# EasyEDA Pro project ProPrj_CSDR_2026-11-13.epro, schematic Schematic1, sheets 1 to 4 of 14

## Sheets
1 MCU: Board Name: Board1; Create Date: 2026-09-28; Page Name: P2; Project Name: CSDR; Schematic Name: Schematic1; Update Date: 2026-09-28; Company: EasyEDA.com; Page Size: A4; Version: V1.0
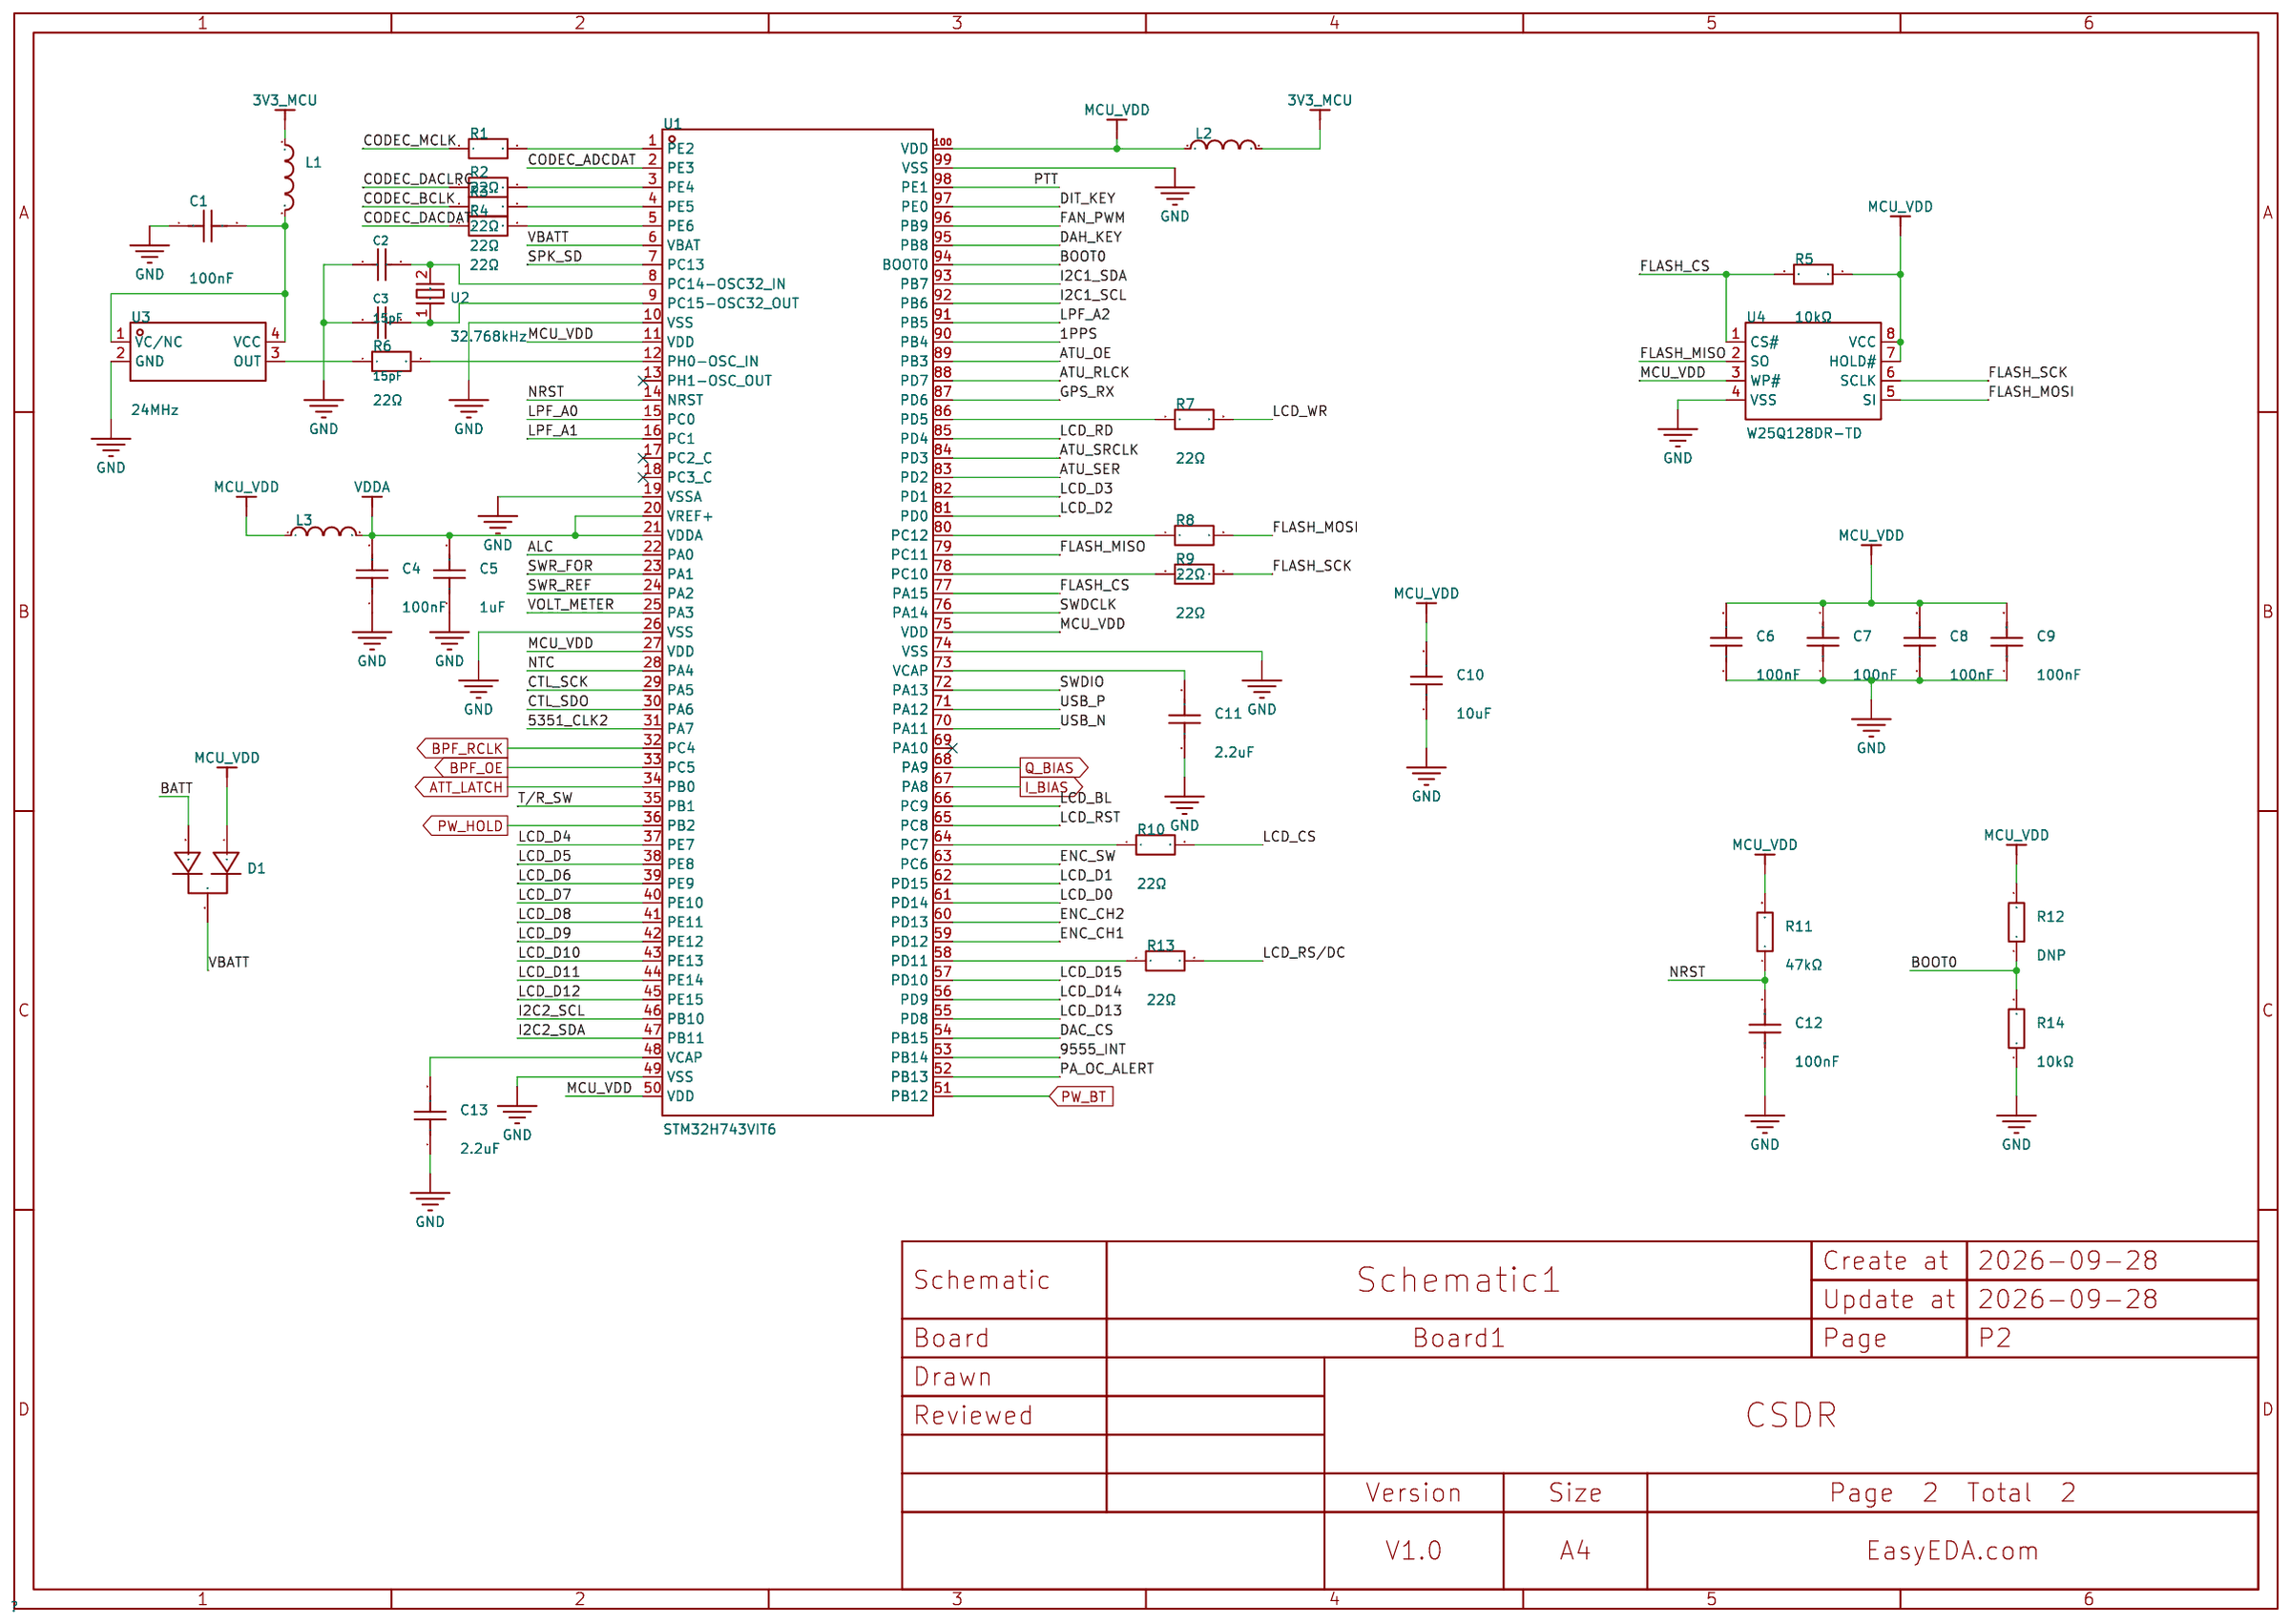
[diagram p2: MCU]
2 AUDIO: Create Date: 2026-09-29; Page Name: P1; Update Date: 2026-09-29
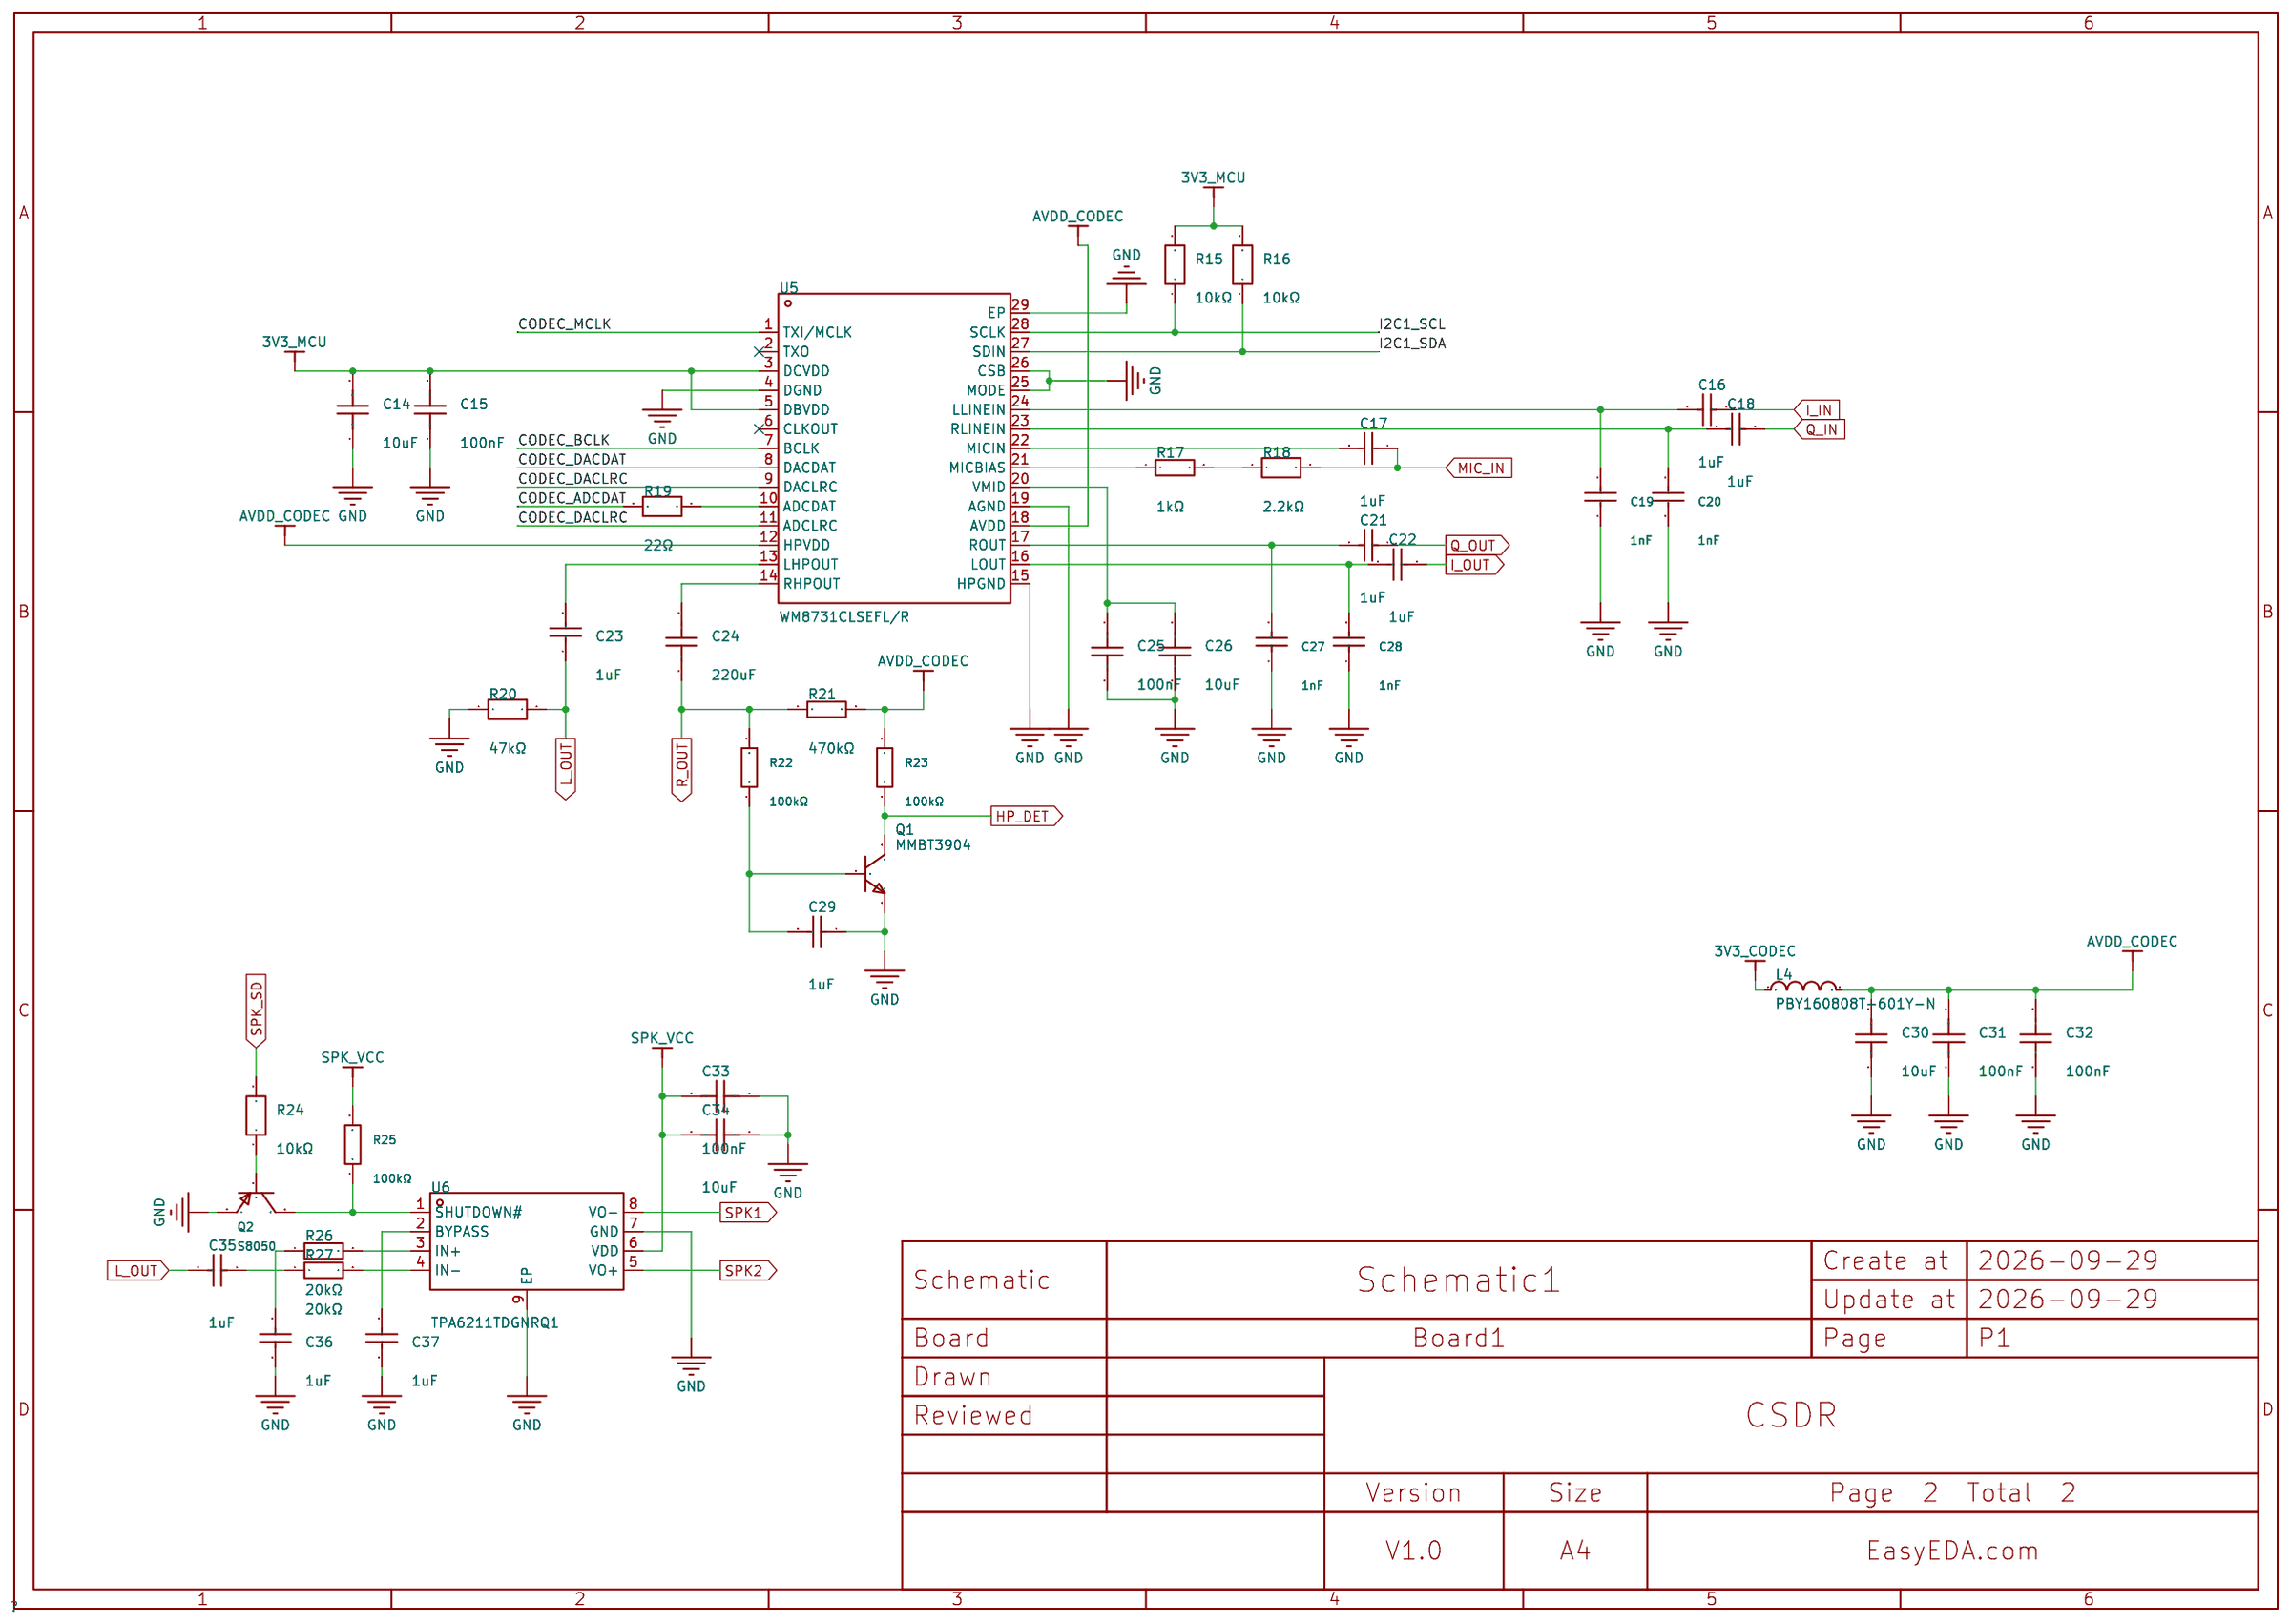
[diagram p3: AUDIO]
3 LO: Create Date: 2026-09-29; Page Name: P1; Update Date: 2026-09-29
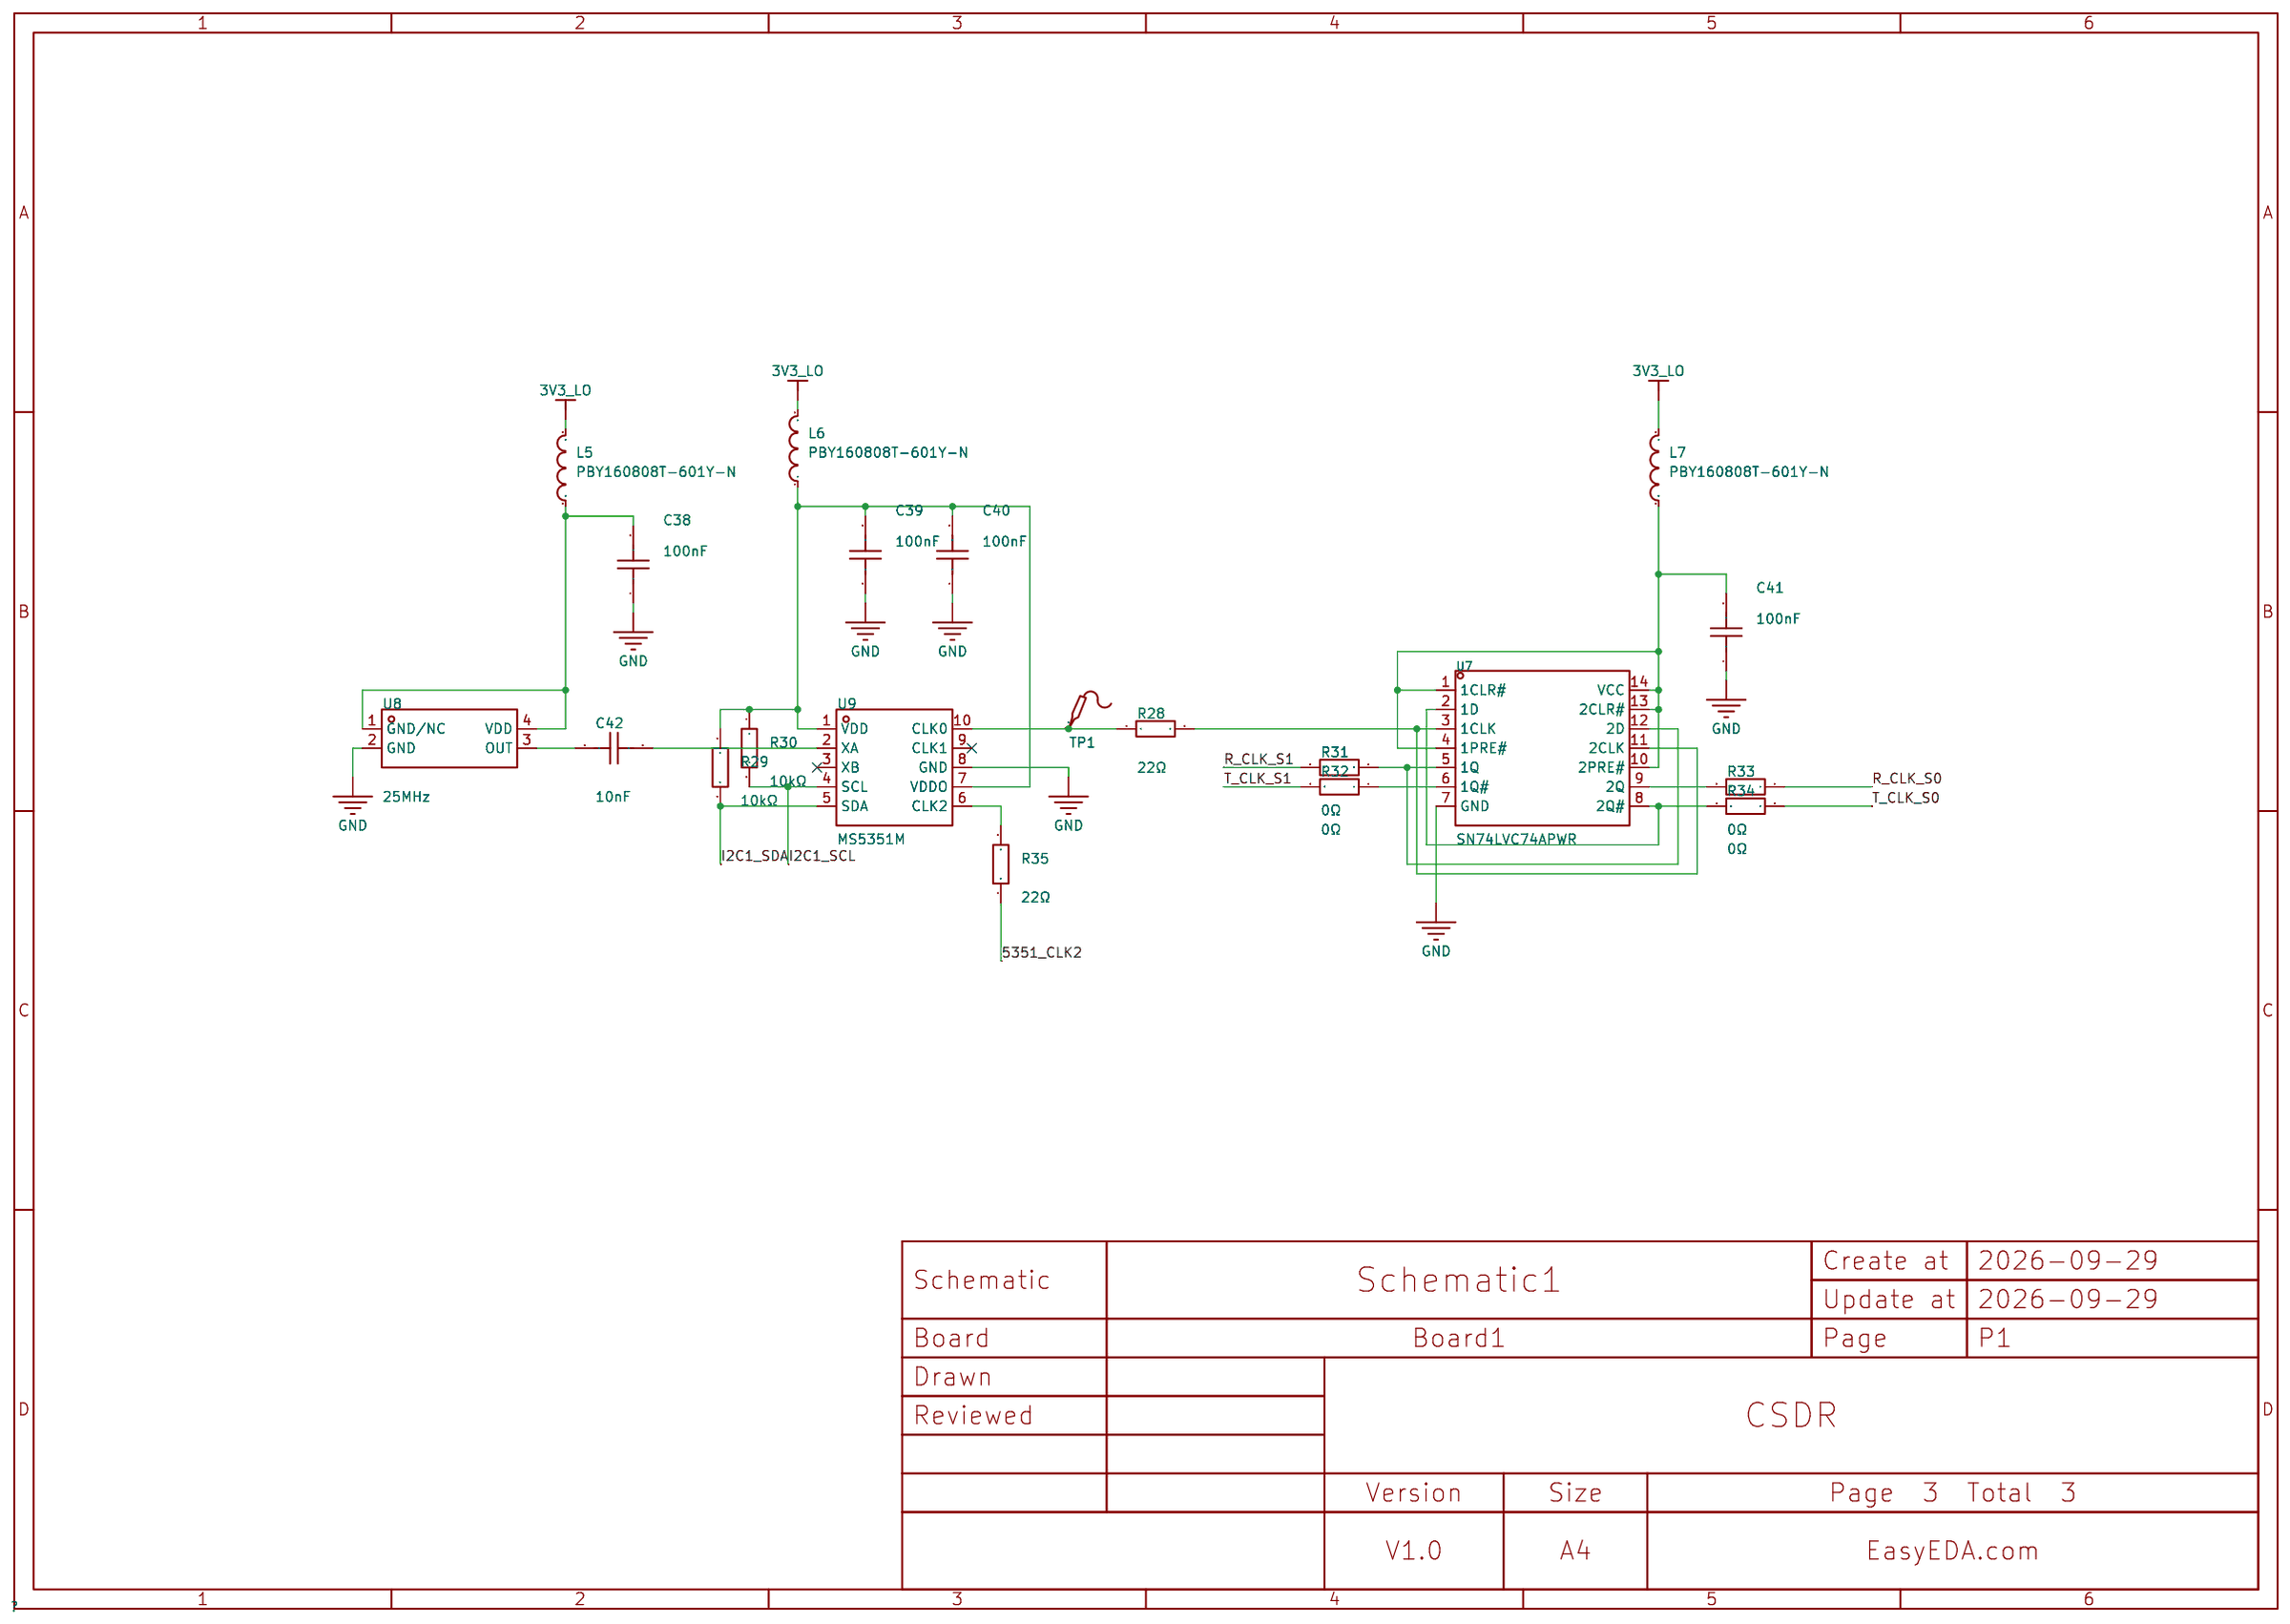
[diagram p4: LO]
4 RX_MIXER: Create Date: 2026-09-30; Page Name: P1; Update Date: 2026-09-30
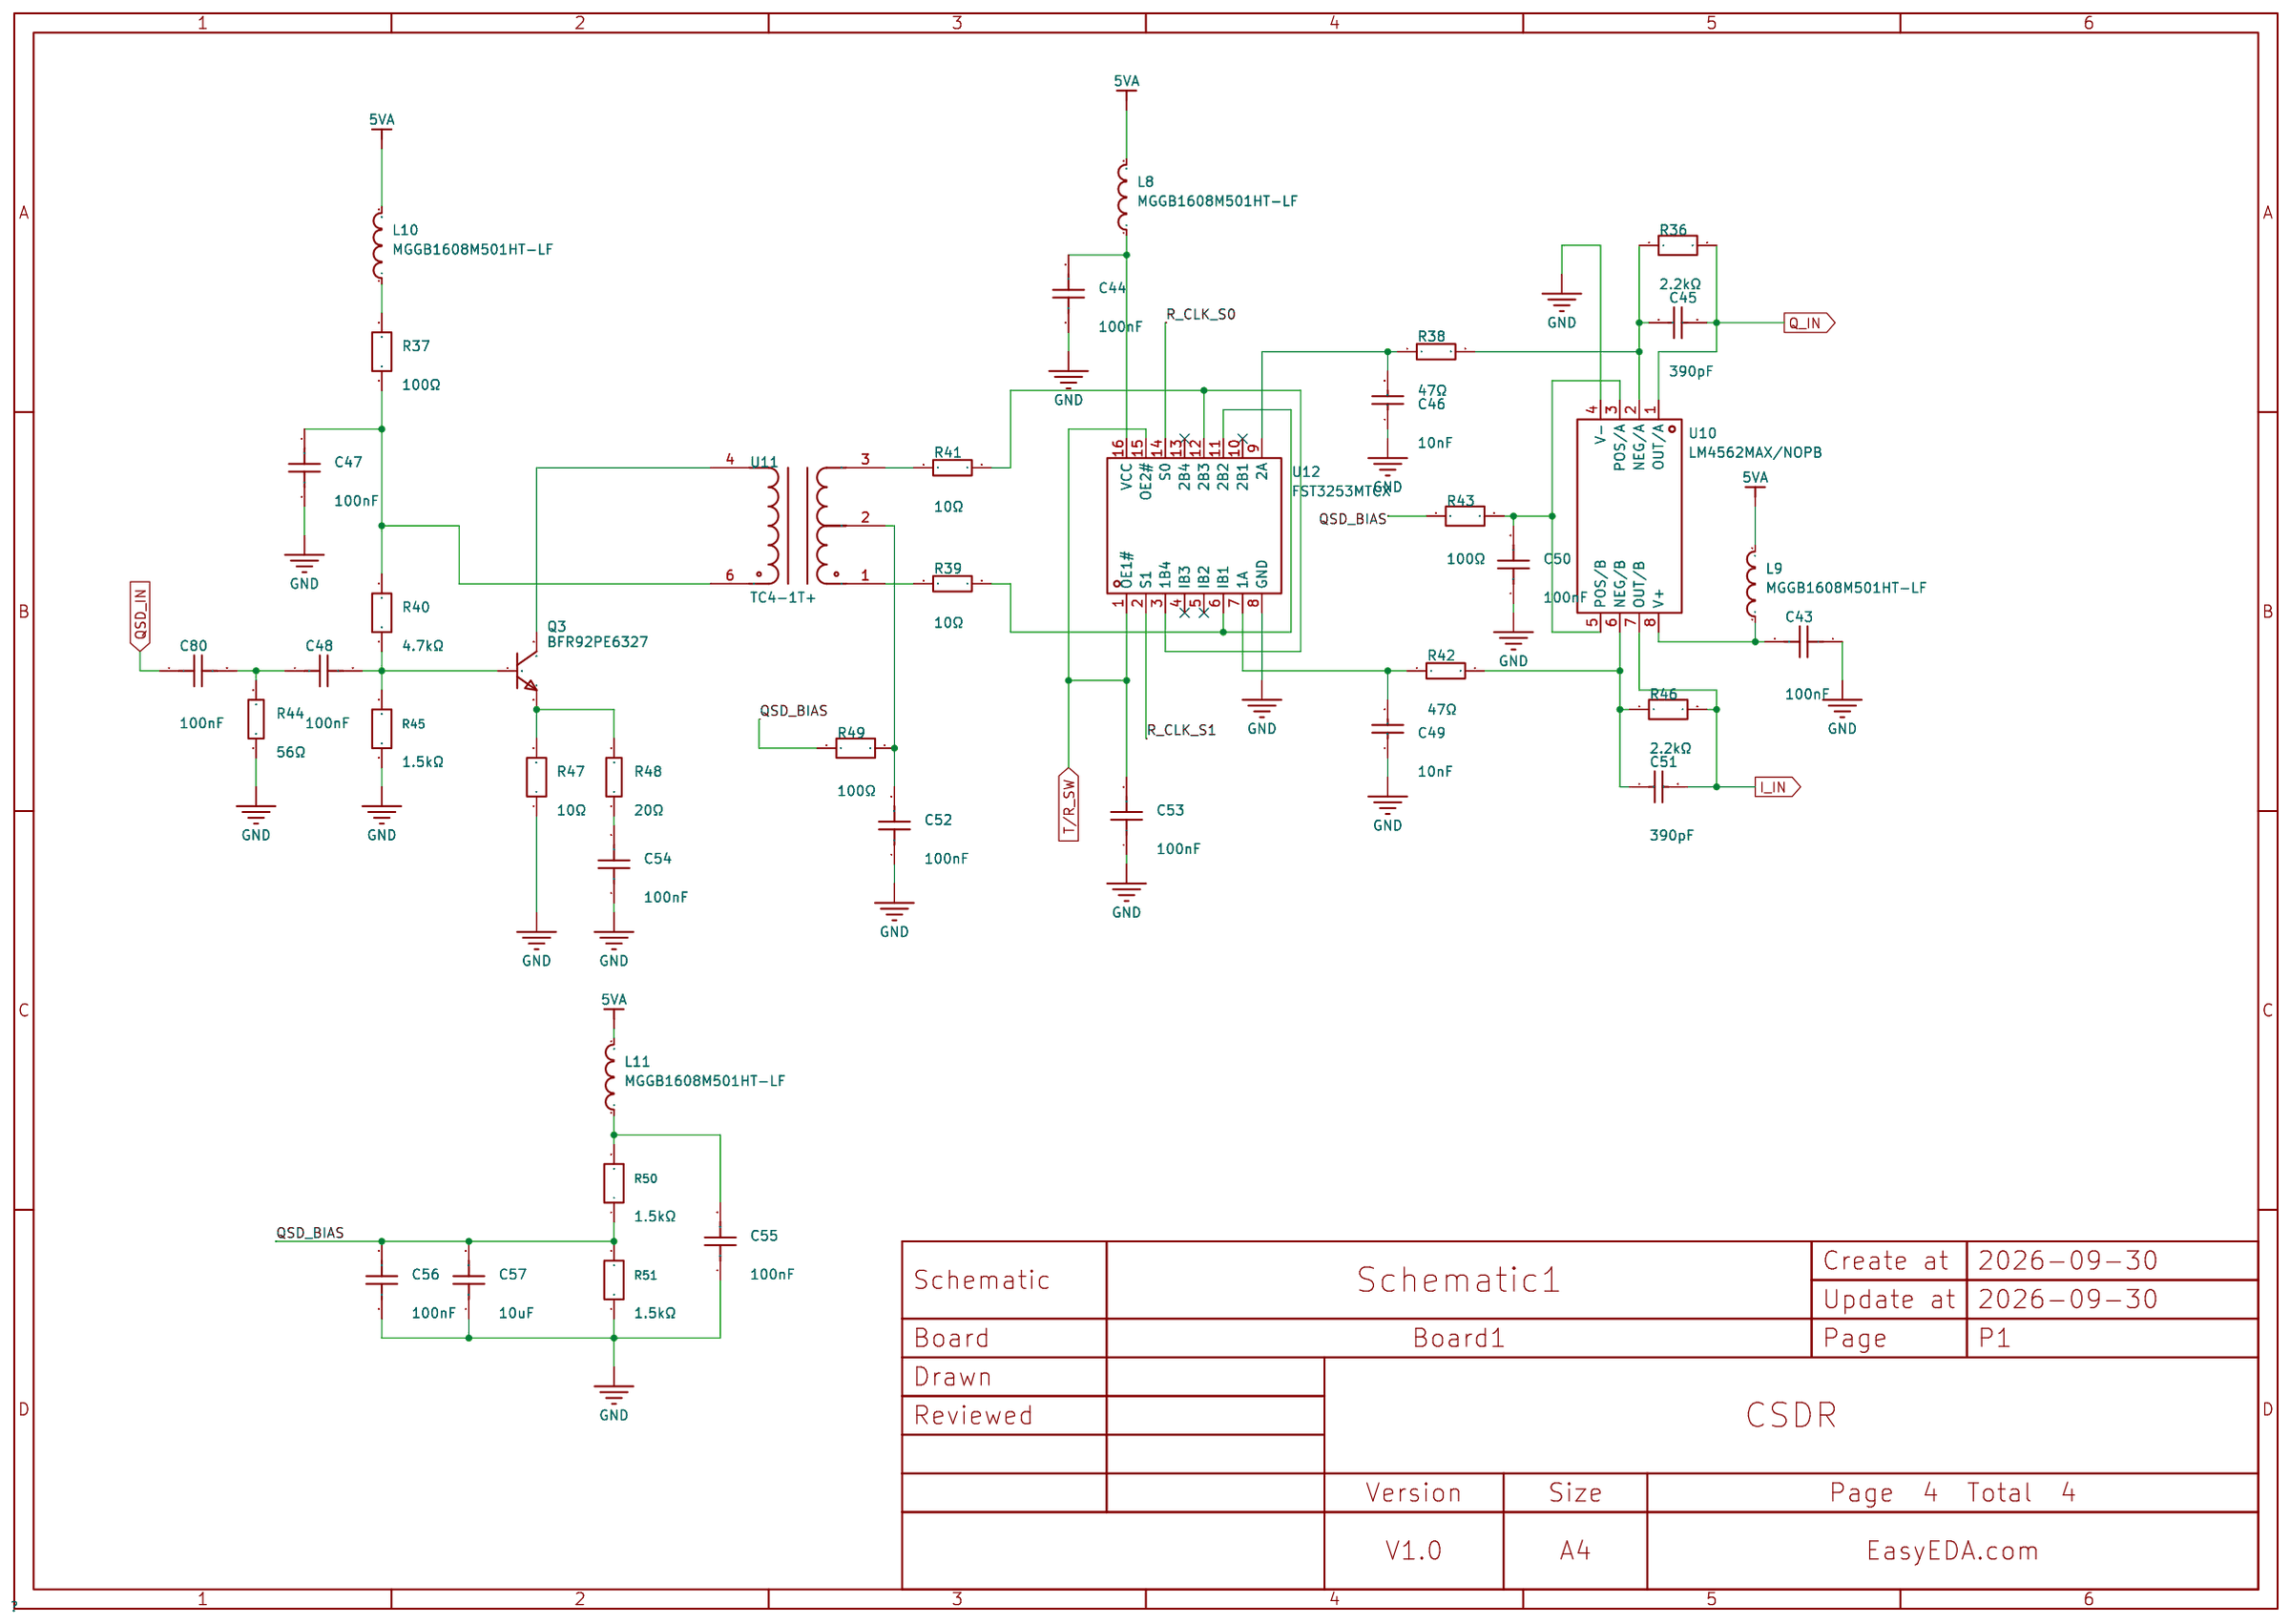
[diagram p5: RX_MIXER]

## Parts
sheet AUDIO
C14  10uF  [C0603]
C15  100nF  [C0603]
C16  1uF  [C0603]
C17  1uF  [C0603]
C18  1uF  [C0603]
C19  1nF  [C0603]
C20  1nF  [C0603]
C21  1uF  [C0603]
C22  1uF  [C0603]
C23  1uF  [C0603]
C24  220uF  [C1206]
C25  100nF  [C0603]
C26  10uF  [C0603]
C27  1nF  [C0603]
C28  1nF  [C0603]
C29  1uF  [C0603]
C30  10uF  [C0603]
C31  100nF  [C0603]
C32  100nF  [C0603]
C33  100nF  [C0603]
C34  10uF  [C0603]
C35  1uF  [C0603]
C36  1uF  [C0603]
C37  1uF  [C0603]
L4  PBY160808T-601Y-N  [L0603]
Q1  MMBT3904  [SOT-23-3_L2.9-W1.3-P1.90-LS2.4-BR]
Q2  S8050  [SOT-23-3_L2.9-W1.3-P1.90-LS2.4-BR]
R15  10kΩ  [R0603]
R16  10kΩ  [R0603]
R17  1kΩ  [R0603]
R18  2.2kΩ  [R0603]
R19  22Ω  [R0603]
R20  47kΩ  [R0603]
R21  470kΩ  [R0603]
R22  100kΩ  [R0603]
R23  100kΩ  [R0603]
R24  10kΩ  [R0603]
R25  100kΩ  [R0603]
R26  20kΩ  [R0603]
R27  20kΩ  [R0603]
U5  WM8731CLSEFL/R  [QFN-28_L5.0-W5.0-P0.50-TL-EP3.2]
U6  TPA6211TDGNRQ1  [HVSSOP-8_L3.0-W3.0-P0.65-LS4.9-BL-EP]
sheet LO
C38  100nF  [C0603]
C39  100nF  [C0603]
C40  100nF  [C0603]
C41  100nF  [C0603]
C42  10nF  [C0603]
L5  PBY160808T-601Y-N  [L0603]
L6  PBY160808T-601Y-N  [L0603]
L7  PBY160808T-601Y-N  [L0603]
R28  22Ω  [R0603]
R29  10kΩ  [R0603]
R30  10kΩ  [R0603]
R31  0Ω  [R0603]
R32  0Ω  [R0603]
R33  0Ω  [R0603]
R34  0Ω  [R0603]
R35  22Ω  [R0603]
TP1  -  [Test-Point-0.5mm]
U7  SN74LVC74APWR  [TSSOP-14_L5.0-W4.4-P0.65-LS6.5-BL]
U8  25MHz  [OSC-SMD_4P-L2.5-W2.0-BL]
U9  MS5351M  [MSOP-10_L3.0-W3.0-P0.50-LS5.0-BL]
sheet MCU
C1  100nF  [C0603]
C2  15pF  [C0603]
C3  15pF  [C0603]
C4  100nF  [C0603]
C5  1uF  [C0603]
C6  100nF  [C0603]
C7  100nF  [C0603]
C8  100nF  [C0603]
C9  100nF  [C0603]
C10  10uF  [C0603]
C11  2.2uF  [C0603]
C12  100nF  [C0603]
C13  2.2uF  [C0603]
D1  BAT54C  [SOT-23-3_L2.9-W1.3-P1.90-LS2.4-BR]
L1  MGGB1608M501HT-LF  [L0603]
L2  MGGB1608M501HT-LF  [L0603]
L3  MGGB1608M501HT-LF  [L0603]
R1  22Ω  [R0603]
R2  22Ω  [R0603]
R3  22Ω  [R0603]
R4  22Ω  [R0603]
R5  10kΩ  [R0603]
R6  22Ω  [R0603]
R7  22Ω  [R0603]
R8  22Ω  [R0603]
R9  22Ω  [R0603]
R10  22Ω  [R0603]
R11  47kΩ  [R0603]
R12  DNP  [R0603]
R13  22Ω  [R0603]
R14  10kΩ  [R0603]
U1  STM32H743VIT6  [LQFP-100_L14.0-W14.0-P0.50-LS16.0-BL]
U2  32.768kHz  [CRYSTAL-SMD_L2.1-W1.2_FC2012AN]
U3  24MHz  [OSC-SMD_4P-L2.5-W2.0-BL-3]
U4  W25Q128DR-TD  [SOP-8_L5.3-W5.3-P1.27-LS7.9-BL]
sheet RX_MIXER
C43  100nF  [C0603]
C44  100nF  [C0603]
C45  390pF  [C0603]
C46  10nF  [C0603]
C47  100nF  [C0603]
C48  100nF  [C0603]
C49  10nF  [C0603]
C50  100nF  [C0603]
C51  390pF  [C0603]
C52  100nF  [C0603]
C53  100nF  [C0603]
C54  100nF  [C0603]
C55  100nF  [C0603]
C56  100nF  [C0603]
C57  10uF  [C0603]
C80  100nF  [C0603]
L8  MGGB1608M501HT-LF  [L0603]
L9  MGGB1608M501HT-LF  [L0603]
L10  MGGB1608M501HT-LF  [L0603]
L11  MGGB1608M501HT-LF  [L0603]
Q3  BFR92PE6327  [SOT-23_L2.9-W1.3-P1.90-LS2.4-BR]
R36  2.2kΩ  [R0603]
R37  100Ω  [R0603]
R38  47Ω  [R0603]
R39  10Ω  [R0603]
R40  4.7kΩ  [R0603]
R41  10Ω  [R0603]
R42  47Ω  [R0603]
R43  100Ω  [R0603]
R44  56Ω  [R0603]
R45  1.5kΩ  [R0603]
R46  2.2kΩ  [R0603]
R47  10Ω  [R0603]
R48  20Ω  [R0603]
R49  100Ω  [R0603]
R50  1.5kΩ  [R0603]
R51  1.5kΩ  [R0603]
U10  LM4562MAX/NOPB  [SOIC-8_L5.0-W4.0-P1.27-LS6.0-BL]
U11  TC4-1T+  [XFMR-SMD_TC1-1TX]
U12  FST3253MTCX  [TSSOP-16_L5.0-W4.4-P0.65-LS6.4-BL]

## Library data of the parts
C10 C14 C26 C30 C34 C57 = GRT188D71A106ME13D: Capacitance:10uF Tolerance:±20% Tolerance:±20% Voltage Rating:10V; LCSC Part Name: 10uF ±20% 10V; Supplier Part: C5279036; Manufacturer: muRata(村田); Supplier Footprint: 0603; JLCPCB Part Class: Extended Part; Datasheet: https://item.szlcsc.com/datasheet/GRT188D71A106ME13D/6013904.html; Supplier: LCSC; Tolerance: ±20%; Voltage Rating: 10V
C15 C25 C31-C33 = GCM188R11H104KA42D: Capacitance:100nF Tolerance:±10% Tolerance:±10% Voltage Rating:50V Temperature Coefficient:-; LCSC Part Name: 100nF ±10% 50V; Supplier Part: C913754; Manufacturer: muRata(村田); Supplier Footprint: 0603; JLCPCB Part Class: Extended Part; Datasheet: https://item.szlcsc.com/datasheet/GCM188R11H104KA42D/984073.html; Supplier: LCSC; Tolerance: ±10%; Voltage Rating: 50V
C16-C18 C21-C23 C29 C35-C37 = CL10A105KA8NNNC: Capacitance:1uF Tolerance:±10% Tolerance:±10% Voltage Rating:25V Temperature Coefficient:X5R; LCSC Part Name: 1uF ±10% 25V; Supplier Part: C5673; Manufacturer: SAMSUNG(三星); Supplier Footprint: 0603; JLCPCB Part Class: Extended Part; Datasheet: https://item.szlcsc.com/datasheet/CL10A105KA8NNNC/6132.html; Supplier: LCSC; Tolerance: ±10%; Voltage Rating: 25V; Temperature Coefficient: X5R
C19 C20 C27 C28 = CC0603KRX7R9BB102: Capacitance: Tolerance:±10% Tolerance:±10% Voltage Rated: Temperature Coefficient:; LCSC Part Name: 1nF ±10% 50V; Supplier Part: C100040; Manufacturer: YAGEO(国巨); Supplier Footprint: 0603; JLCPCB Part Class: Extended Part; Datasheet: https://atta.szlcsc.com/upload/public/pdf/source/20180910/C282072_33301C7F631E79921B82A8DAC6BCC5B3.pdf; Supplier: LCSC; Tolerance: ±10%
C24 = GRM31CR60J227ME11L: Capacitance:220uF Tolerance:±20% Tolerance:±20% Voltage Rating:6.3V Temperature Coefficient:X5R; LCSC Part Name: 220uF ±20% 6.3V; Supplier Part: C412252; Manufacturer: muRata(村田); Supplier Footprint: 1206; JLCPCB Part Class: Extended Part; Datasheet: https://item.szlcsc.com/datasheet/GRM31CR60J227ME11L/404010.html; Supplier: LCSC; Tolerance: ±20%; Voltage Rating: 6.3V; Temperature Coefficient: X5R
L4-L7 = PBY160808T-601Y-N: Impedance @ Frequency:600Ω@100MHz Tolerance:±25% Tolerance:±25% DC Resistance(DCR):200mΩ Current Rating:1A Number of Circuits:1 Operating Temperature:-55℃~+125℃ Operating Temperature:-55℃~+125℃; LCSC Part Name: 单路 0603磁珠 阻抗600Ω@100MHz; Supplier Part: C108301; Manufacturer: Chilisin(奇力新); Supplier Footprint: 0603; JLCPCB Part Class: Extended Part; Datasheet: https://item.szlcsc.com/datasheet/PBY160808T-601Y-N/109520.html; Supplier: LCSC; Impedance @ Frequency: 600Ω@100MHz; Tolerance: ±25%; DC Resistance(DCR): 200mΩ; Current Rating: 1A; Number of Circuits: 1; Operating Temperature: -55℃~+125℃
Q1 = MMBT3904_C54934173: type:NPN Current - Collector(Ic):200mA Collector - Emitter Voltage VCEO:40V Pd - Power Dissipation:200mW DC Current Gain:100 DC Current Gain:100 Transition frequency(fT):300MHz Current - Collector Cutoff:100nA Vce Saturation(VCE(sat)):300mV Operating Temp; Supplier Part: C54934173; Manufacturer: Semiwell(矽门微); Supplier Footprint: SOT-23; JLCPCB Part Class: Extended Part; Datasheet: https://item.szlcsc.com/datasheet/MMBT3904/58484483.html; Supplier: LCSC; type: NPN; Current - Collector(Ic): 200mA; Collector - Emitter Voltage VCEO: 40V; Pd - Power Dissipation: 200mW; DC Current Gain: 100; Transition frequency(fT): 300MHz; Current - Collector Cutoff: 100nA; Vce Saturation(VCE(sat)): 300mV; Operating Temperature: -55℃~+150℃; Emitter-Base Voltage(Vebo): 6V; Number: 1 NPN; Configuration: Standalone
Q2 = S8050_C55127371: Supplier Part: C55127371; Manufacturer: DongChen(东晨); Supplier Footprint: SOT-23; JLCPCB Part Class: Extended Part; Datasheet: https://item.szlcsc.com/datasheet/S8050/58841227.html; Supplier: LCSC
R5 R15 R16 R24 = CRG0603J10K: Type:Thick Film Resistor Resistance:10kΩ Tolerance:±5% Tolerance:±5% Power(Watts):100mW Voltage-Supply(Max):75V Temperature Coefficient:±200ppm/℃ Temperature Coefficient:±200ppm/℃ Operating Temperature:-55℃~+155℃ Operating Temperature:-55℃~+155℃; LCSC Part Name: 厚膜电阻 10kΩ ±5% 100mW; Supplier Part: C2073745; Manufacturer: TE Connectivity(泰科电子); Supplier Footprint: 0603; JLCPCB Part Class: Extended Part; Datasheet: https://item.szlcsc.com/datasheet/CRG0603J10K/2165331.html; Supplier: LCSC; Type: Thick Film Resistor; Tolerance: ±5%; Power(Watts): 100mW; Voltage-Supply(Max): 75V; Temperature Coefficient: ±200ppm/℃; Operating Temperature: -55℃~+155℃
R17 = RC0603FR-071KL: Type:Thick Film Resistor Resistance:1kΩ Tolerance:±1% Tolerance:±1% Power(Watts):100mW Voltage-Supply(Max):75V Temperature Coefficient:±100ppm/℃ Temperature Coefficient:±100ppm/℃ Operating Temperature:-55℃~+155℃ Operating Temperature:-55℃~+155℃; LCSC Part Name: 厚膜电阻 1kΩ ±1%; Supplier Part: C22548; Manufacturer: YAGEO(国巨); Supplier Footprint: 0603; JLCPCB Part Class: Extended Part; Datasheet: https://item.szlcsc.com/datasheet/RC0603FR-071KL/23274.html; Supplier: LCSC; Type: Thick Film Resistor; Tolerance: ±1%; Power(Watts): 100mW; Voltage-Supply(Max): 75V; Temperature Coefficient: ±100ppm/℃; Operating Temperature: -55℃~+155℃
R18 = CRG0603F2K2: Type:Thick Film Resistor Resistance:2.2kΩ Tolerance:±1% Tolerance:±1% Power(Watts):100mW Temperature Coefficient:±100ppm/℃ Temperature Coefficient:±100ppm/℃ Operating Temperature:-55℃~+155℃ Operating Temperature:-55℃~+155℃; LCSC Part Name: 厚膜电阻 2.2kΩ ±1% 100mW; Supplier Part: C3965769; Manufacturer: TE Connectivity(泰科电子); Supplier Footprint: 0603; JLCPCB Part Class: Extended Part; Datasheet: https://item.szlcsc.com/datasheet/CRG0603F2K2/4534332.html; Supplier: LCSC; Type: Thick Film Resistor; Tolerance: ±1%; Power(Watts): 100mW; Temperature Coefficient: ±100ppm/℃; Operating Temperature: -55℃~+155℃
R1-R4 R6-R10 R13 R19 = TD03G22R0BT: Type:Thin Film Resistor Resistance:22Ω Tolerance:±0.1% Tolerance:±0.1% Power(Watts):100mW Voltage-Supply(Max):50V Temperature Coefficient:±25ppm/℃ Temperature Coefficient:±25ppm/℃ Operating Temperature:-55℃~+155℃ Operating Temperature:-55℃~+155℃; LCSC Part Name: 薄膜电阻 22Ω ±0.1% 100mW; Supplier Part: C657279; Manufacturer: FH(风华); Supplier Footprint: 0603; JLCPCB Part Class: Extended Part; Datasheet: https://item.szlcsc.com/datasheet/TD03G22R0BT/696029.html; Supplier: LCSC; Type: Thin Film Resistor; Tolerance: ±0.1%; Power(Watts): 100mW; Voltage-Supply(Max): 50V; Temperature Coefficient: ±25ppm/℃; Operating Temperature: -55℃~+155℃
R20 = FCR0603F47K: Type:Thick Film Resistor Resistance:47kΩ Tolerance:±1% Tolerance:±1% Power(Watts):100mW Voltage-Supply(Max):75V Temperature Coefficient:±100ppm/℃ Temperature Coefficient:±100ppm/℃ Operating Temperature:-55℃~+155℃ Operating Temperature:-55℃~+155℃; LCSC Part Name: 厚膜电阻 47kΩ ±1% 100mW; Supplier Part: C5913180; Manufacturer: VO(翔胜); Supplier Footprint: 0603; JLCPCB Part Class: Extended Part; Datasheet: https://item.szlcsc.com/datasheet/FCR0603F47K/6849692.html; Supplier: LCSC; Type: Thick Film Resistor; Tolerance: ±1%; Power(Watts): 100mW; Voltage-Supply(Max): 75V; Temperature Coefficient: ±100ppm/℃; Operating Temperature: -55℃~+155℃
R21 = RC0603FR-07470KL: Type:Thick Film Resistor Resistance:470kΩ Tolerance:±1% Tolerance:±1% Power(Watts):100mW Voltage-Supply(Max):75V Temperature Coefficient:±100ppm/℃ Temperature Coefficient:±100ppm/℃ Operating Temperature:-55℃~+155℃ Operating Temperature:-55℃~+155℃; LCSC Part Name: 厚膜电阻 470kΩ ±1% 100mW; Supplier Part: C114622; Manufacturer: YAGEO(国巨); Supplier Footprint: 0603; JLCPCB Part Class: Extended Part; Datasheet: https://item.szlcsc.com/datasheet/RC0603FR-07470KL/115866.html; Supplier: LCSC; Type: Thick Film Resistor; Tolerance: ±1%; Power(Watts): 100mW; Voltage-Supply(Max): 75V; Temperature Coefficient: ±100ppm/℃; Operating Temperature: -55℃~+155℃
R22 R23 R25 = RC0603FR-07100KL: Type:Thick Film Resistor Resistance:100kΩ Tolerance:±1% Tolerance:±1% Power(Watts):100mW Voltage-Supply(Max):75V Temperature Coefficient:±100ppm/℃ Temperature Coefficient:±100ppm/℃ Operating Temperature:-55℃~+155℃ Operating Temperature:-55℃~+155℃; LCSC Part Name: 厚膜电阻 100kΩ ±1%; Supplier Part: C14675; Manufacturer: YAGEO(国巨); Supplier Footprint: 0603; JLCPCB Part Class: Extended Part; Datasheet: https://item.szlcsc.com/datasheet/RC0603FR-07100KL/15343.html; Supplier: LCSC; Type: Thick Film Resistor; Tolerance: ±1%; Power(Watts): 100mW; Voltage-Supply(Max): 75V; Temperature Coefficient: ±100ppm/℃; Operating Temperature: -55℃~+155℃
R26 R27 = RC0603FR-0720KL: Type:Thick Film Resistor Resistance:20kΩ Tolerance:±1% Tolerance:±1% Power(Watts):100mW Voltage-Supply(Max):75V Temperature Coefficient:±100ppm/℃ Temperature Coefficient:±100ppm/℃ Operating Temperature:-55℃~+155℃ Operating Temperature:-55℃~+155℃; LCSC Part Name: 厚膜电阻 20kΩ ±1% 100mW; Supplier Part: C105575; Manufacturer: YAGEO(国巨); Supplier Footprint: 0603; JLCPCB Part Class: Extended Part; Datasheet: https://item.szlcsc.com/datasheet/RC0603FR-0720KL/106790.html; Supplier: LCSC; Type: Thick Film Resistor; Tolerance: ±1%; Power(Watts): 100mW; Voltage-Supply(Max): 75V; Temperature Coefficient: ±100ppm/℃; Operating Temperature: -55℃~+155℃
U5 = WM8731CLSEFL/R: Type:Encoder/decoder Interface:Serial Sampling Rate:8kHz~96kHz Sampling Rate:8kHz~96kHz Voltage - Supply:1.8V~3.6V Voltage - Supply:1.8V~3.6V Operating Temperature:-40℃~+85℃ Operating Temperature:-40℃~+85℃ Features:Mute control；Master-slave clock negotiat; LCSC Part Name: 停产 具备耳机驱动和可编程采样率的便携式互联网音频编解码器; Supplier Part: C2651817; Manufacturer: Cirrus Logic(凌云); Supplier Footprint: QFN-28-EP(5x5); JLCPCB Part Class: Extended Part; Datasheet: https://item.szlcsc.com/datasheet/WM8731CLSEFL%252FR/2743726.html; Supplier: LCSC; Type: Encoder/decoder; Interface: Serial; Sampling Rate: 8kHz~96kHz; Voltage - Supply: 1.8V~3.6V; Operating Temperature: -40℃~+85℃; Features: Mute control；Master-slave clock negotiation；On-chip digital gain
U6 = TPA6211TDGNRQ1: LCSC Part Name: 3.1W单声道AB类音频功率放大器; Supplier Part: C2871566; Manufacturer: TI(德州仪器); Supplier Footprint: HVSSOP-8-EP; JLCPCB Part Class: Extended Part; Datasheet: https://www.ti.com/cn/lit/gpn/tpa6211t-q1; Supplier: LCSC
C38-C41 = 0603B104M500NT: Capacitance:100nF Tolerance:±20% Tolerance:±20% Voltage Rating:50V Temperature Coefficient:X7R; LCSC Part Name: 100nF ±20% 50V; Supplier Part: C286510; Manufacturer: FH(风华); Supplier Footprint: 0603; JLCPCB Part Class: Extended Part; Datasheet: https://item.szlcsc.com/datasheet/0603B104M500NT/271775.html; Supplier: LCSC; Tolerance: ±20%; Voltage Rating: 50V; Temperature Coefficient: X7R
C42 = FCC0603B103K500CT: Capacitance:10nF Tolerance:±10% Tolerance:±10% Voltage Rating:50V Temperature Coefficient:X7R Operating Temperature:-55℃~+125℃ Operating Temperature:-55℃~+125℃; LCSC Part Name: 10nF ±10% 50V; Supplier Part: C5137477; Manufacturer: FOJAN(富捷); Supplier Footprint: 0603; JLCPCB Part Class: Extended Part; Datasheet: https://item.szlcsc.com/datasheet/FCC0603B103K500CT/5746979.html; Supplier: LCSC; Tolerance: ±10%; Voltage Rating: 50V; Temperature Coefficient: X7R; Operating Temperature: -55℃~+125℃
R28 = 0603WAF220JT5E: Type:Thick Film Resistors Resistance:22Ω Tolerance:±1% Tolerance:±1% Power(Watts): Overload Voltage (Max): Temperature Coefficient:±100ppm/℃ Temperature Coefficient:±100ppm/℃ Operating Temperature Range:-55℃~+155℃ Operating Temperature Range:-55℃~+155℃; LCSC Part Name: 22Ω ±1% 100mW 厚膜电阻; Supplier Part: C23345; Manufacturer: UNI-ROYAL(厚声); Supplier Footprint: 0603; JLCPCB Part Class: Basic Part; Datasheet: https://atta.szlcsc.com/upload/public/pdf/source/20200306/C422600_1E6D84923E4A46A82E41ADD87F860B5C.pdf; Supplier: LCSC; Type: Thick Film Resistors; Tolerance: ±1%; Temperature Coefficient: ±100ppm/℃; Operating Temperature Range: -55℃~+155℃
R12 R14 R29 R30 = RC0603JR-0710KL: Type:Thick Film Resistor Resistance:10kΩ Tolerance:±5% Tolerance:±5% Power(Watts):100mW Voltage-Supply(Max):75V Temperature Coefficient:±100ppm/℃ Temperature Coefficient:±100ppm/℃ Operating Temperature:-55℃~+155℃ Operating Temperature:-55℃~+155℃; LCSC Part Name: 厚膜电阻 10kΩ ±5% 100mW; Supplier Part: C99198; Manufacturer: YAGEO(国巨); Supplier Footprint: 0603; JLCPCB Part Class: Extended Part; Datasheet: https://item.szlcsc.com/datasheet/RC0603JR-0710KL/100411.html; Supplier: LCSC; Type: Thick Film Resistor; Tolerance: ±5%; Power(Watts): 100mW; Voltage-Supply(Max): 75V; Temperature Coefficient: ±100ppm/℃; Operating Temperature: -55℃~+155℃
R31-R34 = 0603WAF0000T5E: Type:Thick Film Resistor Resistance:0Ω Tolerance:±1% Tolerance:±1% Power(Watts):100mW Voltage-Supply(Max):75V Temperature Coefficient:- Temperature Coefficient:- Operating Temperature:-55℃~+155℃ Operating Temperature:-55℃~+155℃; LCSC Part Name: 厚膜电阻 0Ω ±1%; Supplier Part: C21189; Manufacturer: UNI-ROYAL(厚声); Supplier Footprint: 0603; JLCPCB Part Class: Basic Part; Datasheet: https://item.szlcsc.com/datasheet/0603WAF0000T5E/21903.html; Supplier: LCSC; Type: Thick Film Resistor; Tolerance: ±1%; Power(Watts): 100mW; Voltage-Supply(Max): 75V; Operating Temperature: -55℃~+155℃
R35 = AC0603FR-0722RL: Type:Thick Film Resistor Resistance:22Ω Tolerance:±1% Tolerance:±1% Power(Watts):100mW Voltage-Supply(Max):75V Temperature Coefficient:±100ppm/℃ Temperature Coefficient:±100ppm/℃ Operating Temperature:-55℃~+155℃ Operating Temperature:-55℃~+155℃; LCSC Part Name: 厚膜电阻 22Ω ±1% 100mW; Supplier Part: C138283; Manufacturer: YAGEO(国巨); Supplier Footprint: 0603; JLCPCB Part Class: Extended Part; Datasheet: https://item.szlcsc.com/datasheet/AC0603FR-0722RL/149599.html; Supplier: LCSC; Type: Thick Film Resistor; Tolerance: ±1%; Power(Watts): 100mW; Voltage-Supply(Max): 75V; Temperature Coefficient: ±100ppm/℃; Operating Temperature: -55℃~+155℃
TP1 = Test-Point: Test Point 测试点
U7 = SN74LVC74APWR: Type:D-Type Trigger Type:Rising Edge Voltage - Supply:1.65V~3.6V Voltage - Supply:1.65V~3.6V Clock Frequency:150MHz Function:Set and Reset Number of Elements:2 Number of Bits per Element:1 Output Type:Complementary Propagation Delay:5.2ns@3.3V,50pF Series; LCSC Part Name: 双路上升沿D型触发器 有清零和预设功能; Supplier Part: C350561; Manufacturer: TI(德州仪器); Supplier Footprint: TSSOP-14; JLCPCB Part Class: Extended Part; Datasheet: https://www.ti.com/cn/lit/ds/symlink/sn74lvc74a.pdf; Supplier: LCSC; Type: D-Type; Trigger Type: Rising Edge; Voltage - Supply: 1.65V~3.6V; Clock Frequency: 150MHz; Function: Set and Reset; Number of Elements: 2; Number of Bits per Element: 1; Output Type: Complementary; Propagation Delay: 5.2ns@3.3V,50pF; Series: 74LVC Series; Current - Output Low(IOL): 24mA; Current - Output High(IOH): 24mA; Quiescent Current: 10uA; Input Capacitance: 5pF; Operating Temperature: -40℃~+125℃; Synchronous/Asynchronous: Asynchronous; Setup Time: 3ns; Hold Time: 1ns
U8 = 8122S-25.000NQ33FTL: Frequency:25MHz Frequency Stability:±500ppb Frequency Stability:±500ppb Output Type:Clipped sine wave Voltage - Supply:3.3V Voltage - Supply:3.3V Operating Temperature:-30℃~+85℃ Operating Temperature:-30℃~+85℃; LCSC Part Name: TCXO 2520 4P 25MHz Clipped Sine wave 3.3V ±1ppm -30℃~+85℃(±0.5ppm); Supplier Part: C20623084; Manufacturer: HCI(杭晶); Supplier Footprint: SMD2520-4P; JLCPCB Part Class: Extended Part; Datasheet: https://item.szlcsc.com/datasheet/8122S-25.000NQ33FTL/22019566.html; Supplier: LCSC; Frequency Stability: ±500ppb; Output Type: Clipped sine wave; Voltage - Supply: 3.3V; Operating Temperature: -30℃~+85℃
U9 = MS5351M: Interface:I2C Output Frequency(Max):200MHz Voltage - Supply:2.7V~3.3V Voltage - Supply:2.7V~3.3V Number of Outputs:3 Operating Temperature:-55℃~+150℃ Operating Temperature:-55℃~+150℃ Period Jitter:60ps Cycle-to-Cycle Jitter:60ps Phase Jitter:- Phase Offse; LCSC Part Name: 通用频率综合器; Supplier Part: C1509083; Manufacturer: 杭州瑞盟; Supplier Footprint: MSOP-10; JLCPCB Part Class: Extended Part; Datasheet: https://item.szlcsc.com/datasheet/MS5351M/1599613.html; Supplier: LCSC; Interface: I2C; Output Frequency(Max): 200MHz; Voltage - Supply: 2.7V~3.3V; Number of Outputs: 3; Operating Temperature: -55℃~+150℃; Period Jitter: 60ps; Cycle-to-Cycle Jitter: 60ps; Phase Offset: Support; Clock/Oscillator: External; Output: HCSL
C1 C4 C6-C9 C12 = GRM188R11C104KA01D: Capacitance:100nF Tolerance:±10% Tolerance:±10% Voltage Rating:16V Temperature Coefficient:-; LCSC Part Name: 100nF ±10% 16V; Supplier Part: C86004; Manufacturer: muRata(村田); Supplier Footprint: 0603; JLCPCB Part Class: Extended Part; Datasheet: https://item.szlcsc.com/datasheet/GRM188R11C104KA01D/87180.html; Supplier: LCSC; Tolerance: ±10%; Voltage Rating: 16V
C2 C3 = CC0603JRNPO9BN150: Capacitance:15pF Tolerance:±5% Tolerance:±5% Voltage Rating:50V Temperature Coefficient:NP0; LCSC Part Name: 15pF ±5% 50V; Supplier Part: C107037; Manufacturer: YAGEO(国巨); Supplier Footprint: 0603; JLCPCB Part Class: Extended Part; Datasheet: https://item.szlcsc.com/datasheet/CC0603JRNPO9BN150/108253.html; Supplier: LCSC; Tolerance: ±5%; Voltage Rating: 50V; Temperature Coefficient: NP0
C5 = GCM188D71H105KE36D: Capacitance:1uF Tolerance:±10% Tolerance:±10% Voltage Rating:50V; LCSC Part Name: 1uF ±10% 50V; Supplier Part: C22443289; Manufacturer: muRata(村田); Supplier Footprint: 0603; JLCPCB Part Class: Extended Part; Datasheet: https://item.szlcsc.com/datasheet/GCM188D71H105KE36D/24092295.html; Supplier: LCSC; Tolerance: ±10%; Voltage Rating: 50V
C11 C13 = C1608JB1A225K080AC: Capacitance:2.2uF Tolerance:±10% Tolerance:±10% Voltage Rating:10V Temperature Coefficient:-; LCSC Part Name: 2.2uF ±10% 10V; Supplier Part: C19284663; Manufacturer: TDK; Supplier Footprint: 0603; JLCPCB Part Class: Extended Part; Datasheet: https://item.szlcsc.com/datasheet/C1608JB1A225K080AC/20572254.html; Supplier: LCSC; Tolerance: ±10%; Voltage Rating: 10V
D1 = BAT54C_C42441801: Diode Configuration:Independent Voltage - Forward(Vf@If):1V@100mA Voltage - DC Reverse(Vr):30V Current - Rectified:200mA Reverse Leakage Current (Ir):2uA@25V Non-Repetitive Peak Forward Surge Current:600mA; Supplier Part: C42441801; Manufacturer: TDSEMIC(拓电半导体); Supplier Footprint: SOT-23; JLCPCB Part Class: Extended Part; Datasheet: https://item.szlcsc.com/datasheet/BAT54C/44491126.html; Supplier: LCSC; Diode Configuration: Independent; Voltage - Forward(Vf@If): 1V@100mA; Voltage - DC Reverse(Vr): 30V; Current - Rectified: 200mA; Reverse Leakage Current (Ir): 2uA@25V; Non-Repetitive Peak Forward Surge Current: 600mA
L1-L3 L8-L11 = MGGB1608M501HT-LF: Impedance @ Frequency:500Ω@100MHz Tolerance:±25% Tolerance:±25% DC Resistance(DCR):- Current Rating:- Number of Circuits:1 Operating Temperature:- Operating Temperature:-; LCSC Part Name: 单路 0603磁珠 阻抗500Ω@100MHz; Supplier Part: C281149; Manufacturer: microgate(麦捷科技); Supplier Footprint: 0603; JLCPCB Part Class: Extended Part; Datasheet: https://item.szlcsc.com/datasheet/MGGB1608M501HT-LF/267482.html; Supplier: LCSC; Impedance @ Frequency: 500Ω@100MHz; Tolerance: ±25%; Number of Circuits: 1
R11 = AC0603FR-0747KL: Type:Thick Film Resistors Resistance: Tolerance:±1% Tolerance:±1% Power(Watts): Overload Voltage (Max): Temperature Coefficient:±100ppm/℃ Temperature Coefficient:±100ppm/℃ Operating Temperature Range:-55℃~+155℃ Operating Temperature Range:-55℃~+155℃; LCSC Part Name: 厚膜电阻 47kΩ ±1% 100mW; Supplier Part: C111134; Manufacturer: YAGEO(国巨); Supplier Footprint: 0603; JLCPCB Part Class: Extended Part; Datasheet: https://atta.szlcsc.com/upload/public/pdf/source/20180927/C229861_4ABDC471507C1ED6AFB4BA66AFC8620A.pdf; Supplier: LCSC; Type: Thick Film Resistors; Tolerance: ±1%; Temperature Coefficient: ±100ppm/℃; Operating Temperature Range: -55℃~+155℃
U1 = STM32H743VIT6_C114409: CPU Core:ARM Cortex-M7 CPU Maximum Speed:480MHz Core Size:32 Bit Program Storage Size:2MB Program Memory Type:FLASH RAM Size:1MB EEPROM:- Number of I/O:82 ADC (Bit):16bit DAC (Bit):12bit Oscillator Type:Built-in Voltage - Supply:1.71V~3.6V Voltage - Suppl; LCSC Part Name: 带DSP和DP-FPU的高性能ARM Cortex-M7 MCU，具有2 MB Flash、1 MB RAM、480 MHz CPU、ART加速器、一级缓存、外部存储器接口和大量外设; Supplier Part: C114409; Manufacturer: ST(意法半导体); Supplier Footprint: LQFP-100(14x14); JLCPCB Part Class: Extended Part; Datasheet: https://item.szlcsc.com/datasheet/STM32H743VIT6/115649.html; Supplier: LCSC; CPU Core: ARM Cortex-M7; CPU Maximum Speed: 480MHz; Core Size: 32 Bit; Program Storage Size: 2MB; Program Memory Type: FLASH; RAM Size: 1MB; Number of I/O: 82; ADC (Bit): 16bit; DAC (Bit): 12bit; Oscillator Type: Built-in; Voltage - Supply: 1.71V~3.6V; Operating Temperature: -40℃~+85℃
U2 = FK122HIHM0.032768-T3: Frequency:32.768kHz Normal temperature Frequency Tolerance:±10ppm Normal temperature Frequency Tolerance:±10ppm Load Capacitance:12.5pF Equivalent Series Resistance(ESR):90kΩ Operating Temperature:-40℃~+85℃ Operating Temperature:-40℃~+85℃; LCSC Part Name: 32.768kHz ±10ppm 12.5pF; Supplier Part: C6251300; Manufacturer: ABRACON; Supplier Footprint: 0805; JLCPCB Part Class: Extended Part; Datasheet: https://item.szlcsc.com/datasheet/FK122HIHM0.032768-T3/7196669.html; Supplier: LCSC; Normal temperature Frequency Tolerance: ±10ppm; Load Capacitance: 12.5pF; Equivalent Series Resistance(ESR): 90kΩ; Operating Temperature: -40℃~+85℃
U3 = X1G0051610026: Frequency:24MHz; Supplier Part: C3007498; Manufacturer: EPSON(爱普生); Supplier Footprint: SMD2520-4P; JLCPCB Part Class: Extended Part; Datasheet: https://item.szlcsc.com/datasheet/X1G0051610026/3495840.html; Supplier: LCSC
U4 = W25Q128DR-TD: Interface:SPI Memory Size:128Mbit Clock Frequency:120MHz Voltage - Supply:2.7V~3.6V Voltage - Supply:2.7V~3.6V Standby Supply Current:2uA Program / Erase Cycles:100,000 cycles Write Cycle Time (tWC):- Page Programming Time (Tpp):700us Block Erase Time(tBE; LCSC Part Name: 128Mbit SPI NOR 闪存; Supplier Part: C49211308; Manufacturer: TDSEMIC(拓电半导体); Supplier Footprint: SOP-8-208mil; JLCPCB Part Class: Extended Part; Datasheet: https://item.szlcsc.com/datasheet/W25Q128DR-TD/51620452.html; Supplier: LCSC; Interface: SPI; Memory Size: 128Mbit; Clock Frequency: 120MHz; Voltage - Supply: 2.7V~3.6V; Standby Supply Current: 2uA; Program / Erase Cycles: 100,000 cycles; Page Programming Time (Tpp): 700us; Block Erase Time(tBE): 400ms; Data Retention - TDR (Year): 20 Years; Operating Temperature: -40℃~+85℃; Features: Hardware write protection；Absolute write protection；Write enable latch；Software write protection；Power-on reset
C43 C44 C47 C48 C50 C52-C56 C80 = C1608JB1H104M080AA: Capacitance:100nF Tolerance:±20% Tolerance:±20% Voltage Rating:50V Temperature Coefficient:-; LCSC Part Name: 100nF ±20% 50V; Supplier Part: C19426095; Manufacturer: TDK; Supplier Footprint: 0603; JLCPCB Part Class: Extended Part; Datasheet: https://item.szlcsc.com/datasheet/C1608JB1H104M080AA/20714413.html; Supplier: LCSC; Tolerance: ±20%; Voltage Rating: 50V
C45 C51 = CC0603JRNPO9BN391: Capacitance:390pF Tolerance:±5% Tolerance:±5% Voltage Rating:50V Temperature Coefficient:NP0; LCSC Part Name: 390pF ±5% 50V; Supplier Part: C107050; Manufacturer: YAGEO(国巨); Supplier Footprint: 0603; JLCPCB Part Class: Extended Part; Datasheet: https://item.szlcsc.com/datasheet/CC0603JRNPO9BN391/108266.html; Supplier: LCSC; Tolerance: ±5%; Voltage Rating: 50V; Temperature Coefficient: NP0
C46 C49 = CL10B103KB8NNNC: Capacitance:10nF Tolerance:±10% Tolerance:±10% Voltage Rating:50V Temperature Coefficient:X7R; LCSC Part Name: 10nF ±10% 50V; Supplier Part: C1589; Manufacturer: SAMSUNG(三星); Supplier Footprint: 0603; JLCPCB Part Class: Extended Part; Datasheet: https://item.szlcsc.com/datasheet/CL10B103KB8NNNC/1941.html; Supplier: LCSC; Tolerance: ±10%; Voltage Rating: 50V; Temperature Coefficient: X7R
Q3 = BFR92PE6327: type:NPN Current - Collector(Ic):45mA Collector - Emitter Voltage VCEO:15V Pd - Power Dissipation:280mW DC Current Gain:70 DC Current Gain:70 Transition frequency(fT):5GHz Current - Collector Cutoff:100nA Operating Temperature:-55℃~+150℃ Operating Tempera; LCSC Part Name: NPN 电流:45mA 电压:15V; Supplier Part: C273250; Manufacturer: Infineon(英飞凌); Supplier Footprint: SOT-23; JLCPCB Part Class: Extended Part; Datasheet: https://item.szlcsc.com/datasheet/BFR92PE6327/261842.html; Supplier: LCSC; type: NPN; Current - Collector(Ic): 45mA; Collector - Emitter Voltage VCEO: 15V; Pd - Power Dissipation: 280mW; DC Current Gain: 70; Transition frequency(fT): 5GHz; Current - Collector Cutoff: 100nA; Operating Temperature: -55℃~+150℃; Emitter-Base Voltage(Vebo): 2.5V; Number: 1 NPN
R36 R46 = CRGH0603F2K2: Type:Thick Film Resistor Resistance:2.2kΩ Tolerance:±1% Tolerance:±1% Power(Watts):200mW Voltage-Supply(Max):50V Temperature Coefficient:±100ppm/℃ Temperature Coefficient:±100ppm/℃ Operating Temperature:-55℃~+155℃ Operating Temperature:-55℃~+155℃; LCSC Part Name: 厚膜电阻 2.2kΩ ±1% 200mW; Supplier Part: C2085883; Manufacturer: TE Connectivity(泰科电子); Supplier Footprint: 0603; JLCPCB Part Class: Extended Part; Datasheet: https://item.szlcsc.com/datasheet/CRGH0603F2K2/2177471.html; Supplier: LCSC; Type: Thick Film Resistor; Tolerance: ±1%; Power(Watts): 200mW; Voltage-Supply(Max): 50V; Temperature Coefficient: ±100ppm/℃; Operating Temperature: -55℃~+155℃
R37 R43 R49 = CL0603JN100RP: Type:Thick Film Resistor Resistance:100Ω Tolerance:±5% Tolerance:±5% Power(Watts):100mW Voltage-Supply(Max):75V Operating Temperature:-55℃~+70℃ Operating Temperature:-55℃~+70℃; LCSC Part Name: 厚膜电阻 100Ω ±5% 100mW; Supplier Part: C51035928; Manufacturer: 昶龙科技; Supplier Footprint: 0603; JLCPCB Part Class: Extended Part; Datasheet: https://item.szlcsc.com/datasheet/CL0603JN100RP/53683736.html; Supplier: LCSC; Type: Thick Film Resistor; Tolerance: ±5%; Power(Watts): 100mW; Voltage-Supply(Max): 75V; Operating Temperature: -55℃~+70℃
R38 R42 = RC0603FR-0747RL: Type:Thick Film Resistor Resistance:47Ω Tolerance:±1% Tolerance:±1% Power(Watts):100mW Voltage-Supply(Max):75V Temperature Coefficient:±100ppm/℃ Temperature Coefficient:±100ppm/℃ Operating Temperature:-55℃~+155℃ Operating Temperature:-55℃~+155℃; LCSC Part Name: 厚膜电阻 47Ω ±1% 100mW; Supplier Part: C114623; Manufacturer: YAGEO(国巨); Supplier Footprint: 0603; JLCPCB Part Class: Extended Part; Datasheet: https://item.szlcsc.com/datasheet/RC0603FR-0747RL/115867.html; Supplier: LCSC; Type: Thick Film Resistor; Tolerance: ±1%; Power(Watts): 100mW; Voltage-Supply(Max): 75V; Temperature Coefficient: ±100ppm/℃; Operating Temperature: -55℃~+155℃
R39 R41 = RC0603FR-0710RL: Type:Thick Film Resistor Resistance:10Ω Tolerance:±1% Tolerance:±1% Power(Watts):100mW Voltage-Supply(Max):75V Temperature Coefficient:±200ppm/℃ Temperature Coefficient:±200ppm/℃ Operating Temperature:-55℃~+155℃ Operating Temperature:-55℃~+155℃; LCSC Part Name: 厚膜电阻 10Ω ±1% 100mW; Supplier Part: C109318; Manufacturer: YAGEO(国巨); Supplier Footprint: 0603; JLCPCB Part Class: Extended Part; Datasheet: https://item.szlcsc.com/datasheet/RC0603FR-0710RL/110539.html; Supplier: LCSC; Type: Thick Film Resistor; Tolerance: ±1%; Power(Watts): 100mW; Voltage-Supply(Max): 75V; Temperature Coefficient: ±200ppm/℃; Operating Temperature: -55℃~+155℃
R40 = CRG0603F4K7: Type:Thick Film Resistor Resistance:4.7kΩ Tolerance:±1% Tolerance:±1% Power(Watts):100mW Temperature Coefficient:±100ppm/℃ Temperature Coefficient:±100ppm/℃ Operating Temperature:-55℃~+155℃ Operating Temperature:-55℃~+155℃; LCSC Part Name: 厚膜电阻 4.7kΩ ±1% 100mW; Supplier Part: C6157603; Manufacturer: TE Connectivity(泰科电子); Supplier Footprint: 0603; JLCPCB Part Class: Extended Part; Datasheet: https://item.szlcsc.com/datasheet/CRG0603F4K7/7101644.html; Supplier: LCSC; Type: Thick Film Resistor; Tolerance: ±1%; Power(Watts): 100mW; Temperature Coefficient: ±100ppm/℃; Operating Temperature: -55℃~+155℃
R44 = RC0603JR-0756RL: Type:Thick Film Resistors Resistance:56Ω Tolerance:±5% Tolerance:±5% Power(Watts):100mW Voltage-Supply(Max):75V Temperature Coefficient:±100ppm/℃ Temperature Coefficient:±100ppm/℃ Operating Temperature:-55℃~+155℃ Operating Temperature:-55℃~+155℃; LCSC Part Name: 厚膜电阻 56Ω ±5% 100mW; Supplier Part: C127448; Manufacturer: YAGEO(国巨); Supplier Footprint: 0603; JLCPCB Part Class: Extended Part; Datasheet: https://item.szlcsc.com/datasheet/RC0603JR-0756RL/138730.html; Supplier: LCSC; Type: Thick Film Resistors; Tolerance: ±5%; Power(Watts): 100mW; Voltage-Supply(Max): 75V; Temperature Coefficient: ±100ppm/℃; Operating Temperature: -55℃~+155℃
R45 R50 R51 = CRG0603F1K5: Type:Thick Film Resistor Resistance:1.5kΩ Tolerance:±1% Tolerance:±1% Power(Watts):100mW Voltage-Supply(Max):75V Temperature Coefficient:±100ppm/℃ Temperature Coefficient:±100ppm/℃ Operating Temperature:-55℃~+155℃ Operating Temperature:-55℃~+155℃; LCSC Part Name: 厚膜电阻 1.5kΩ ±1% 100mW; Supplier Part: C2073657; Manufacturer: TE Connectivity(泰科电子); Supplier Footprint: 0603; JLCPCB Part Class: Extended Part; Datasheet: https://item.szlcsc.com/datasheet/CRG0603F1K5/2165243.html; Supplier: LCSC; Type: Thick Film Resistor; Tolerance: ±1%; Power(Watts): 100mW; Voltage-Supply(Max): 75V; Temperature Coefficient: ±100ppm/℃; Operating Temperature: -55℃~+155℃
R47 = TD03H10R0BT: Type:Thin Film Resistor Resistance: Tolerance:±0.1% Tolerance:±0.1% Power(Watts): Temperature Coefficient:±50ppm/℃ Temperature Coefficient:±50ppm/℃; LCSC Part Name: 10Ω ±0.1%; Supplier Part: C5120005; Manufacturer: FH(风华); Supplier Footprint: 0603; JLCPCB Part Class: Extended Part; Datasheet: https://atta.szlcsc.com/upload/public/pdf/source/20220726/97950D08E3EA8CC4F1F63A0C564F66E4.pdf; Supplier: LCSC; Type: Thin Film Resistor; Tolerance: ±0.1%; Temperature Coefficient: ±50ppm/℃
R48 = RC0603FR-0720RL: Type:Thick Film Resistor Resistance:20Ω Tolerance:±1% Tolerance:±1% Power(Watts):100mW Voltage-Supply(Max):75V Temperature Coefficient:±100ppm/℃ Temperature Coefficient:±100ppm/℃ Operating Temperature:-55℃~+155℃ Operating Temperature:-55℃~+155℃; LCSC Part Name: 厚膜电阻 20Ω ±1% 100mW; Supplier Part: C125758; Manufacturer: YAGEO(国巨); Supplier Footprint: 0603; JLCPCB Part Class: Extended Part; Datasheet: https://item.szlcsc.com/datasheet/RC0603FR-0720RL/137037.html; Supplier: LCSC; Type: Thick Film Resistor; Tolerance: ±1%; Power(Watts): 100mW; Voltage-Supply(Max): 75V; Temperature Coefficient: ±100ppm/℃; Operating Temperature: -55℃~+155℃
U10 = LM4562MAX/NOPB: Class:- Speaker Channels:2-Channel Output Power:- Total Harmonic Distortion + Noise (THD+N):0.00003% Quiescent Current:10mA Signal-to-Noise Ratio:- Power Supply Rejection Ratio (PSRR):120dB Efficiency:- Number of Inputs:- Features:- Voltage - Supply:-17V~; LCSC Part Name: LM4562 双高性能高保真音频运算放大器; Supplier Part: C57367; Manufacturer: TI(德州仪器); Supplier Footprint: SOIC-8; JLCPCB Part Class: Extended Part; Datasheet: https://www.ti.com/cn/lit/ds/symlink/lm4562.pdf; Supplier: LCSC; Speaker Channels: 2-Channel; Total Harmonic Distortion + Noise (THD+N): 0.00003%; Quiescent Current: 10mA; Power Supply Rejection Ratio (PSRR): 120dB; Voltage - Supply: -17V~-2.5V；2.5V~17V; Operating Temperature: -40℃~+85℃
U11 = TC4-1T+: Applications:- Function:Transformer Frequency Range:200kHz~450MHz Frequency Range:200kHz~450MHz Voltage - Supply:- Voltage - Supply:- Operating Temperature:-20℃~+85℃ Operating Temperature:-20℃~+85℃ Features:-; LCSC Part Name: 贴片式射频变压器，50Ω，0.5至300 MHz; Supplier Part: C879856; Manufacturer: Mini-Circuits; Supplier Footprint: SMD,3.8x3.8mm; JLCPCB Part Class: Extended Part; Datasheet: https://item.szlcsc.com/datasheet/TC4-1T%252B/940697.html; Supplier: LCSC; Function: Transformer; Frequency Range: 200kHz~450MHz; Operating Temperature: -20℃~+85℃
U12 = FST3253MTCX: Type:- Voltage Supply Source:Single Supply Voltage - Supply:4V~5.5V Voltage - Supply:4V~5.5V Number of lines:- Number of lines:- Current - Output Low(IOL):- Current - Output High(IOH):- Operating temperature:-40℃~+85℃ Operating temperature:-40℃~+85℃ Propa; Supplier Part: C903754; Manufacturer: onsemi(安森美); Supplier Footprint: TSSOP-16; JLCPCB Part Class: Extended Part; Datasheet: https://item.szlcsc.com/datasheet/FST3253MTCX/969192.html; Supplier: LCSC; Voltage Supply Source: Single Supply; Voltage - Supply: 4V~5.5V; Operating temperature: -40℃~+85℃; Propagation Delay: 5.3ns@5.5V,50pF; Quiescent Current: 3uA; Function: Output enable high-impedance；Tri-state output

## Nets
3V3_CODEC: L4.1 ; also on sheet 12
3V3_LO: L5.2 L6.2 L7.2 ; also on sheet 5 12
3V3_MCU: C14.2 C15.2 L1.1 L2.2 R15.2 R16.2 U5.3(DCVDD) U5.5(DBVDD) ; also on sheet 7 10 11 12
5VA: L8.2 L9.2 L10.2 L11.2 ; also on sheet 5 7 9 12
AVDD_CODEC: C30.2 C31.2 C32.2 L4.2 R21.2 R23.2 U5.12(HPVDD) U5.18(AVDD)
GND: C1.1 C2.1 C3.1 C4.1 C5.1 C6.1 C7.1 C8.1 C9.1 C10.1 C11.1 C12.1 C13.1 C14.1 C15.1 C19.1 C20.1 C25.2 C26.2 C27.1 C28.1 C29.1 C30.1 C31.1 C32.1 C33.1 C34.1 C36.1 C37.1 C38.1 C39.1 C40.1 C41.1 C43.1 C44.1 C46.1 C47.2 C49.1 C50.1 C52.1 C53.1 C54.1 C55.1 C56.1 C57.1 Q1.2(E) Q2.2(E) R14.1 R20.1 R44.1 R45.1 R47.1 R51.1 U1.10(VSS) U1.19(VSSA) U1.26(VSS) U1.49(VSS) U1.74(VSS) U1.99(VSS) U3.2(GND) U4.4(VSS) U5.4(DGND) U5.15(HPGND) U5.19(AGND) U5.25(MODE) U5.26(CSB) U5.29(EP) U6.7(GND) U6.9(EP) U7.7(GND) U8.2(GND) U9.8(GND) U10.4(V-) U12.8(GND) ; also on sheet 5 6 7 8 9 10 11 12 13 14
VBATT: D1.3 U1.6(VBAT) ; also on sheet 11
VDDA: C4.2 C5.2 L3.2 U1.20(VREF+) U1.21(VDDA) ; also on sheet 14
1PPS: U1.90(PB4) ; also on sheet 11
5351_CLK2: R35.1 U1.31(PA7)
9555_INT: U1.53(PB14) ; also on sheet 13
ALC: U1.22(PA0) ; also on sheet 14
ATT_LATCH: U1.34(PB0) ; also on sheet 10
ATU_OE: U1.89(PB3)
ATU_RLCK: U1.88(PD7)
ATU_SER: U1.83(PD2)
ATU_SRCLK: U1.84(PD3)
BATT: D1.2 ; also on sheet 13
BOOT0: R12.1 R14.2 U1.94(BOOT0)
BPF_OE: U1.33(PC5) ; also on sheet 7
BPF_RCLK: U1.32(PC4) ; also on sheet 7
CODEC_ADCDAT: R19.1 U1.2(PE3)
CODEC_BCLK: R3.1 U5.7(BCLK)
CODEC_DACDAT: R4.1 U5.8(DACDAT)
CODEC_DACLRC: R2.1 U5.9(DACLRC) U5.11(ADCLRC)
CODEC_MCLK: R1.1 U5.1(TXI/MCLK)
CTL_SCK: U1.29(PA5) ; also on sheet 7 10
CTL_SDO: U1.30(PA6) ; also on sheet 7 10
DAC_CS: U1.54(PB15)
DAH_KEY: U1.95(PB8) ; also on sheet 13
DIT_KEY: U1.97(PE0) ; also on sheet 13
ENC_CH1: U1.59(PD12) ; also on sheet 13
ENC_CH2: U1.60(PD13) ; also on sheet 13
ENC_SW: U1.63(PC6) ; also on sheet 13
FAN_PWM: U1.96(PB9)
FLASH_CS: R5.2 U1.77(PA15) U4.1(CS#)
FLASH_MISO: U1.79(PC11) U4.2(SO)
FLASH_MOSI: R8.2 U4.5(SI)
FLASH_SCK: R9.2 U4.6(SCLK)
GPS_RX: U1.87(PD6) ; also on sheet 11
HP_DET: Q1.3(C) R23.1
I2C1_SCL: R15.1 R30.2 U1.92(PB6) U5.28(SCLK) U9.4(SCL)
I2C1_SDA: R16.1 R29.2 U1.93(PB7) U5.27(SDIN) U9.5(SDA)
I2C2_SCL: U1.46(PB10) ; also on sheet 13
I2C2_SDA: U1.47(PB11) ; also on sheet 13
I_BIAS: U1.67(PA8) ; also on sheet 5
I_IN: C16.1 C51.2 R46.2 U10.7(OUT/B)
I_OUT: C22.1 ; also on sheet 5
L_OUT: C23.1 C35.2 R20.2
LCD_BL: U1.66(PC9) ; also on sheet 13
LCD_CS: R10.2 ; also on sheet 13
LCD_D0: U1.61(PD14) ; also on sheet 13
LCD_D1: U1.62(PD15) ; also on sheet 13
LCD_D2: U1.81(PD0) ; also on sheet 13
LCD_D3: U1.82(PD1) ; also on sheet 13
LCD_D4: U1.37(PE7) ; also on sheet 13
LCD_D5: U1.38(PE8) ; also on sheet 13
LCD_D6: U1.39(PE9) ; also on sheet 13
LCD_D7: U1.40(PE10) ; also on sheet 13
LCD_D8: U1.41(PE11) ; also on sheet 13
LCD_D9: U1.42(PE12) ; also on sheet 13
LCD_D10: U1.43(PE13) ; also on sheet 13
LCD_D11: U1.44(PE14) ; also on sheet 13
LCD_D12: U1.45(PE15) ; also on sheet 13
LCD_D13: U1.55(PD8) ; also on sheet 13
LCD_D14: U1.56(PD9) ; also on sheet 13
LCD_D15: U1.57(PD10) ; also on sheet 13
LCD_RD: U1.85(PD4) ; also on sheet 13
LCD_RS/DC: R13.2 ; also on sheet 13
LCD_RST: U1.65(PC8) ; also on sheet 13
LCD_WR: R7.2 ; also on sheet 13
LPF_A0: U1.15(PC0) ; also on sheet 9
LPF_A1: U1.16(PC1) ; also on sheet 9
LPF_A2: U1.91(PB5) ; also on sheet 9
MCU_VDD: C6.2 C7.2 C8.2 C9.2 C10.2 D1.1 L2.1 L3.1 R5.1 R11.2 R12.2 U1.11(VDD) U1.27(VDD) U1.50(VDD) U1.75(VDD) U1.100(VDD) U4.3(WP#) U4.7(HOLD#) U4.8(VCC) ; also on sheet 13
MIC_IN: C17.1 R18.2 ; also on sheet 13
NRST: C12.2 R11.1 U1.14(NRST)
NTC: U1.28(PA4)
PA_OC_ALERT: U1.52(PB13)
PTT: U1.98(PE1) ; also on sheet 13
PW_BT: U1.51(PB12) ; also on sheet 12
PW_HOLD: U1.36(PB2) ; also on sheet 12
Q_BIAS: U1.68(PA9) ; also on sheet 5
Q_IN: C18.1 C45.2 R36.2 U10.1(OUT/A)
Q_OUT: C21.1 ; also on sheet 5
QSD_BIAS: C56.2 C57.2 R43.2 R49.2 R50.1 R51.2
QSD_IN: C80.1 ; also on sheet 7
R_CLK_S0: R33.1 U12.14(S0)
R_CLK_S1: R31.2 U12.2(S1)
R_OUT: C24.1 R21.1 R22.2 ; also on sheet 13
SPK1: U6.8(VO-) ; also on sheet 13
SPK2: U6.5(VO+) ; also on sheet 13
SPK_SD: R24.2 U1.7(PC13) ; also on sheet 13
SPK_VCC: C33.2 C34.2 R25.2 U6.6(VDD) ; also on sheet 12
SWDCLK: U1.76(PA14) ; also on sheet 13
SWDIO: U1.72(PA13) ; also on sheet 13
SWR_FOR: U1.23(PA1)
SWR_REF: U1.24(PA2)
T/R_SW: C53.2 U1.35(PB1) U12.1(OE1#) U12.15(OE2#) ; also on sheet 5 6 13
T_CLK_S0: R34.1 ; also on sheet 5
T_CLK_S1: R32.2 ; also on sheet 5
USB_N: U1.70(PA11) ; also on sheet 13
USB_P: U1.71(PA12) ; also on sheet 13
VOLT_METER: U1.25(PA3)
$2N1: C1.2 L1.2 U3.1(VC/NC) U3.4(VCC)
$2N3: C3.2 U1.9(PC15-OSC32_OUT) U2.1
$2N4: C2.2 U1.8(PC14-OSC32_IN) U2.2(GND)
$2N9: R7.1 U1.86(PD5)
$2N10: R13.1 U1.58(PD11)
$2N11: R10.1 U1.64(PC7)
$2N12: R9.1 U1.78(PC10)
$2N13: R8.1 U1.80(PC12)
$2N15: C13.2 U1.48(VCAP)
$2N17: C11.2 U1.73(VCAP)
$2N128: R6.2 U1.12(PH0-OSC_IN)
$2N129: R1.2 U1.1(PE2)
$2N134: R2.2 U1.3(PE4)
$2N138: R4.2 U1.5(PE6)
$2N139: R3.2 U1.4(PE5)
$2N149: R6.1 U3.3(OUT)
$3N1: R19.2 U5.10(ADCDAT)
$3N24: C23.2 U5.13(LHPOUT)
$3N25: C24.2 U5.14(RHPOUT)
$3N34: C17.2 U5.22(MICIN)
$3N37: C21.2 C27.2 U5.17(ROUT)
$3N38: C22.2 C28.2 U5.16(LOUT)
$3N39: C16.2 C19.2 U5.24(LLINEIN)
$3N40: C18.2 C20.2 U5.23(RLINEIN)
$3N52: Q2.3(C) R25.1 U6.1(SHUTDOWN#)
$3N57: C35.1 R27.1
$3N63: C25.1 C26.1 U5.20(VMID)
$3N71: R17.1 U5.21(MICBIAS)
$3N72: R17.2 R18.1
$3N75: Q2.1(B) R24.1
$3N79: C29.2 Q1.1(B) R22.1
$3N81: R27.2 U6.4(IN-)
$3N82: C36.2 R26.1
$3N83: R26.2 U6.3(IN+)
$3N84: C37.2 U6.2(BYPASS)
$4N1: C42.2 U9.2(XA)
$4N2: C42.1 U8.3(OUT)
$4N3: C38.2 L5.1 U8.1(GND/NC) U8.4(VDD)
$4N7: C39.2 C40.2 L6.1 R29.1 R30.1 U9.1(VDD) U9.7(VDDO)
$4N20: R35.2 U9.6(CLK2)
$4N21: R28.1 TP1.1 U9.10(CLK0)
$4N22: R28.2 U7.3(1CLK) U7.11(2CLK)
$4N25: R31.1 U7.5(1Q) U7.12(2D)
$4N26: R32.1 U7.6(1Q#)
$4N27: C41.2 L7.1 U7.1(1CLR#) U7.4(1PRE#) U7.10(2PRE#) U7.13(2CLR#) U7.14(VCC)
$4N28: R34.2 U7.2(1D) U7.8(2Q#)
$4N29: R33.2 U7.9(2Q)
$5N9: Q3.3(C) U11.4
$5N10: C48.2 Q3.1(B) R40.1 R45.2
$5N12: C47.1 R37.1 R40.2 U11.6
$5N13: C52.2 R49.1 U11.2
$5N14: Q3.2(E) R47.2 R48.2
$5N15: C54.2 R48.1
$5N22: C43.2 L9.1 U10.8(V+)
$5N29: R41.2 U12.3(1B4) U12.12(2B3)
$5N30: C46.2 R38.1 U12.9(2A)
$5N31: C49.2 R42.1 U12.7(1A)
$5N37: C45.1 R36.1 R38.2 U10.2(NEG/A)
$5N44: C44.2 L8.1 U12.16(VCC)
$5N53: L10.1 R37.2
$5N55: C48.1 C80.2 R44.2
$5N56: C55.2 L11.1 R50.2
$5N71: C50.2 R43.1 U10.3(POS/A) U10.5(POS/B)
$5N75: C51.1 R42.2 R46.1 U10.6(NEG/B)
$5N81: R39.2 U12.6(IB1) U12.11(2B2)
$5N82: R39.1 U11.1
$5N83: R41.1 U11.3

Not connected (* = marked no-connect by the designer): U1 13(PH1-OSC_OUT)* 17(PC2_C)* 18(PC3_C)* 69(PA10)*; U5 2(TXO)* 6(CLKOUT)*; U9 3(XB)* 9(CLK1)*; U12 4(IB3)* 5(IB2)* 10(2B1)* 13(2B4)*
